# EAGLE schematic RU-PCBA-2X2-001-03 (EAGLE 9.7.0), part 1 of 5

## Sheet 1 of 17: Row 1
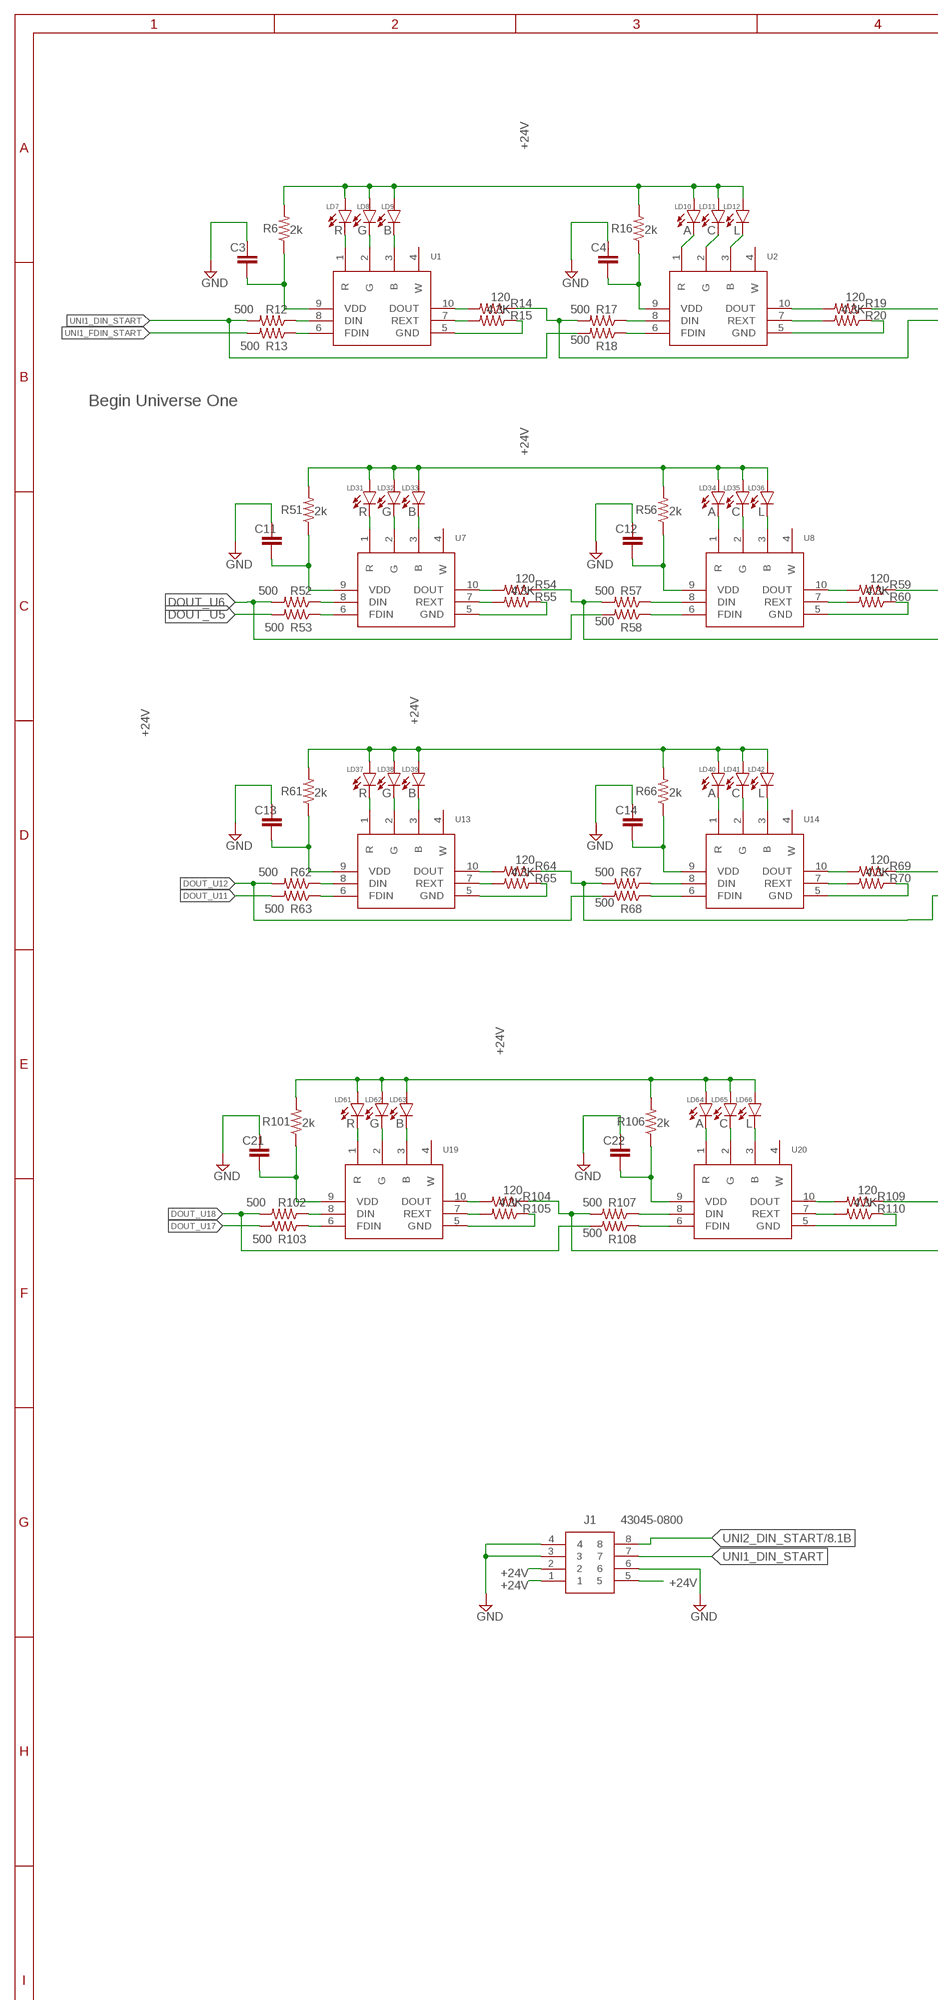
[diagram p0: schematic, sheet 1, part 1 of 2]
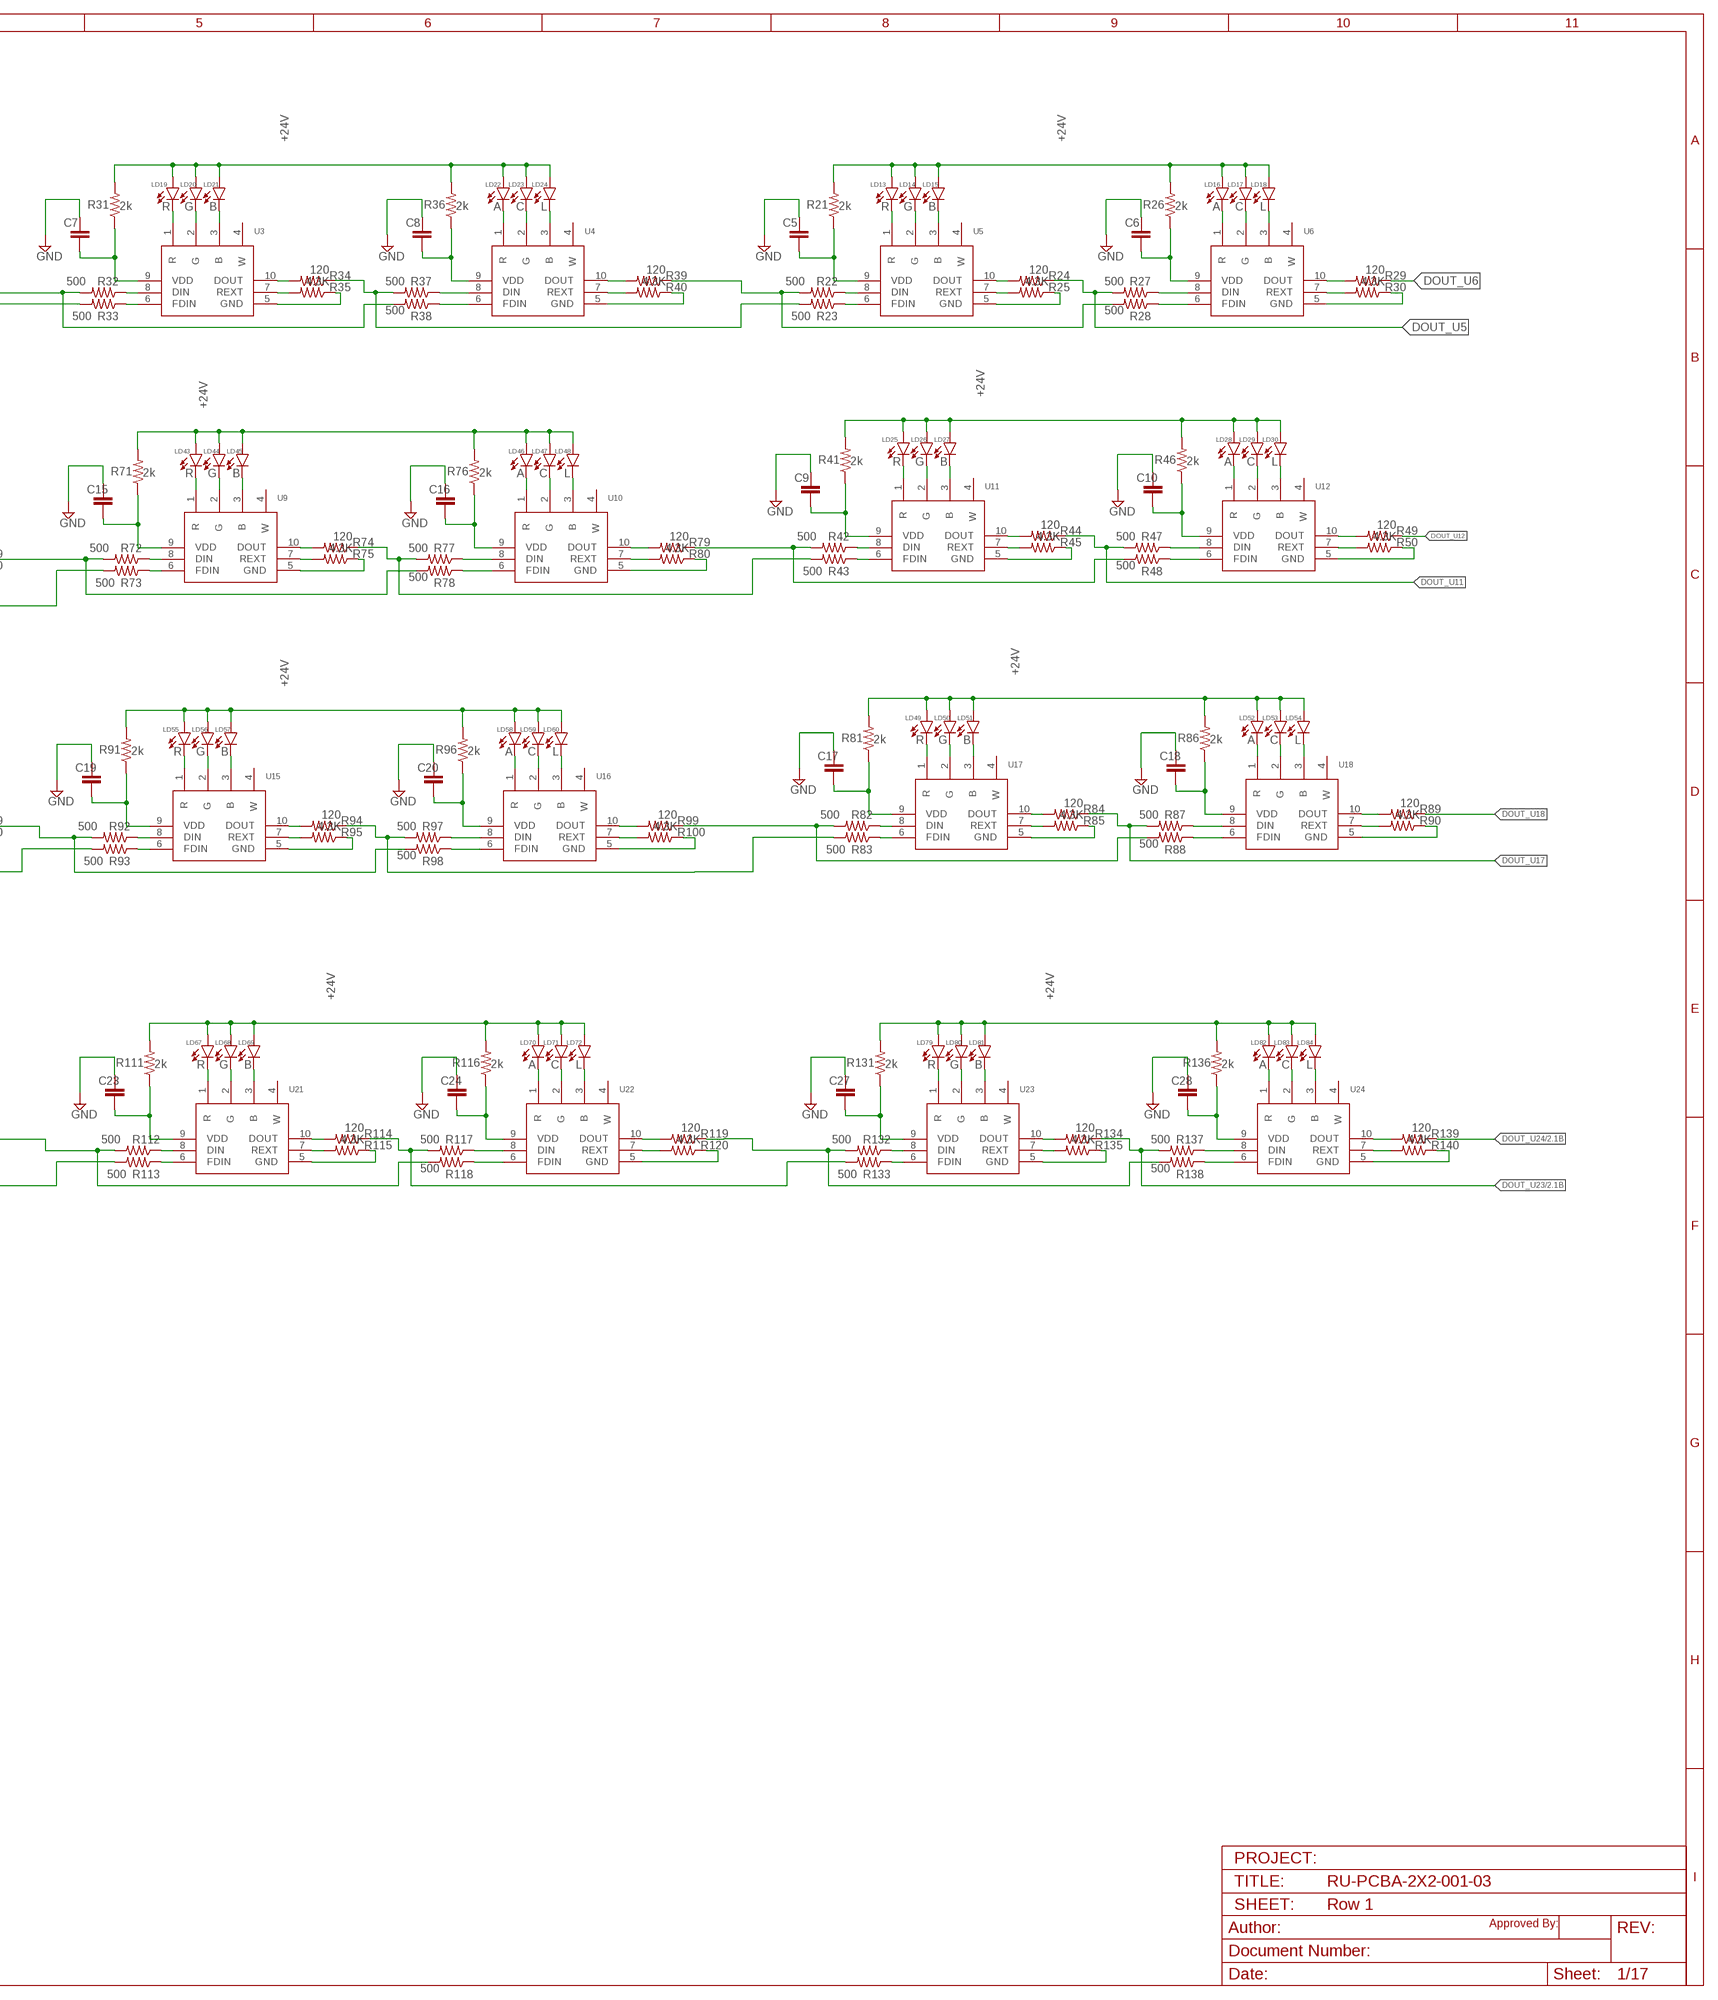
[diagram p1: schematic, sheet 1, part 2 of 2]

### Parts
C3  C-EUC1206  [C1206]
C4  C-EUC1206  [C1206]
C5  C-EUC1206  [C1206]
C6  C-EUC1206  [C1206]
C7  C-EUC1206  [C1206]
C8  C-EUC1206  [C1206]
C9  C-EUC1206  [C1206]
C10  C-EUC1206  [C1206]
C11  C-EUC1206  [C1206]
C12  C-EUC1206  [C1206]
C13  C-EUC1206  [C1206]
C14  C-EUC1206  [C1206]
C15  C-EUC1206  [C1206]
C16  C-EUC1206  [C1206]
C17  C-EUC1206  [C1206]
C18  C-EUC1206  [C1206]
C19  C-EUC1206  [C1206]
C20  C-EUC1206  [C1206]
C21  C-EUC1206  [C1206]
C22  C-EUC1206  [C1206]
C23  C-EUC1206  [C1206]
C24  C-EUC1206  [C1206]
C27  C-EUC1206  [C1206]
C28  C-EUC1206  [C1206]
J1  43045-0800  [43045-08(00,01,02,10)]
LD7  R  5050LED  [5050LED]
LD8  G  5050LED  [5050LED]
LD9  B  5050LED  [5050LED]
LD10  A  5050LED  [5050LED]
LD11  C  5050LED  [5050LED]
LD12  L  5050LED  [5050LED]
LD13  R  5050LED  [5050LED]
LD14  G  5050LED  [5050LED]
LD15  B  5050LED  [5050LED]
LD16  A  5050LED  [5050LED]
LD17  C  5050LED  [5050LED]
LD18  L  5050LED  [5050LED]
LD19  R  5050LED  [5050LED]
LD20  G  5050LED  [5050LED]
LD21  B  5050LED  [5050LED]
LD22  A  5050LED  [5050LED]
LD23  C  5050LED  [5050LED]
LD24  L  5050LED  [5050LED]
LD25  R  5050LED  [5050LED]
LD26  G  5050LED  [5050LED]
LD27  B  5050LED  [5050LED]
LD28  A  5050LED  [5050LED]
LD29  C  5050LED  [5050LED]
LD30  L  5050LED  [5050LED]
LD31  R  5050LED  [5050LED]
LD32  G  5050LED  [5050LED]
LD33  B  5050LED  [5050LED]
LD34  A  5050LED  [5050LED]
LD35  C  5050LED  [5050LED]
LD36  L  5050LED  [5050LED]
LD37  R  5050LED  [5050LED]
LD38  G  5050LED  [5050LED]
LD39  B  5050LED  [5050LED]
LD40  A  5050LED  [5050LED]
LD41  C  5050LED  [5050LED]
LD42  L  5050LED  [5050LED]
LD43  R  5050LED  [5050LED]
LD44  G  5050LED  [5050LED]
LD45  B  5050LED  [5050LED]
LD46  A  5050LED  [5050LED]
LD47  C  5050LED  [5050LED]
LD48  L  5050LED  [5050LED]
LD49  R  5050LED  [5050LED]
LD50  G  5050LED  [5050LED]
LD51  B  5050LED  [5050LED]
LD52  A  5050LED  [5050LED]
LD53  C  5050LED  [5050LED]
LD54  L  5050LED  [5050LED]
LD55  R  5050LED  [5050LED]
LD56  G  5050LED  [5050LED]
LD57  B  5050LED  [5050LED]
LD58  A  5050LED  [5050LED]
LD59  C  5050LED  [5050LED]
LD60  L  5050LED  [5050LED]
LD61  R  5050LED  [5050LED]
LD62  G  5050LED  [5050LED]
LD63  B  5050LED  [5050LED]
LD64  A  5050LED  [5050LED]
LD65  C  5050LED  [5050LED]
LD66  L  5050LED  [5050LED]
LD67  R  5050LED  [5050LED]
LD68  G  5050LED  [5050LED]
LD69  B  5050LED  [5050LED]
LD70  A  5050LED  [5050LED]
LD71  C  5050LED  [5050LED]
LD72  L  5050LED  [5050LED]
LD79  R  5050LED  [5050LED]
LD80  G  5050LED  [5050LED]
LD81  B  5050LED  [5050LED]
LD82  A  5050LED  [5050LED]
LD83  C  5050LED  [5050LED]
LD84  L  5050LED  [5050LED]
R6  2k  R-US_R1206  [R1206]
R12  500  R-US_R0805  [R0805]
R13  500  R-US_R0805  [R0805]
R14  120  R-US_R0805  [R0805]
R15  4.3K  R-US_R0805  [R0805]
R16  2k  R-US_R1206  [R1206]
R17  500  R-US_R0805  [R0805]
R18  500  R-US_R0805  [R0805]
R19  120  R-US_R0805  [R0805]
R20  4.3K  R-US_R0805  [R0805]
R21  2k  R-US_R1206  [R1206]
R22  500  R-US_R0805  [R0805]
R23  500  R-US_R0805  [R0805]
R24  120  R-US_R0805  [R0805]
R25  4.3K  R-US_R0805  [R0805]
R26  2k  R-US_R1206  [R1206]
R27  500  R-US_R0805  [R0805]
R28  500  R-US_R0805  [R0805]
R29  120  R-US_R0805  [R0805]
R30  4.3K  R-US_R0805  [R0805]
R31  2k  R-US_R1206  [R1206]
R32  500  R-US_R0805  [R0805]
R33  500  R-US_R0805  [R0805]
R34  120  R-US_R0805  [R0805]
R35  4.3K  R-US_R0805  [R0805]
R36  2k  R-US_R1206  [R1206]
R37  500  R-US_R0805  [R0805]
R38  500  R-US_R0805  [R0805]
R39  120  R-US_R0805  [R0805]
R40  4.3K  R-US_R0805  [R0805]
R41  2k  R-US_R1206  [R1206]
R42  500  R-US_R0805  [R0805]
R43  500  R-US_R0805  [R0805]
R44  120  R-US_R0805  [R0805]
R45  4.3K  R-US_R0805  [R0805]
R46  2k  R-US_R1206  [R1206]
R47  500  R-US_R0805  [R0805]
R48  500  R-US_R0805  [R0805]
R49  120  R-US_R0805  [R0805]
R50  4.3K  R-US_R0805  [R0805]
R51  2k  R-US_R1206  [R1206]
R52  500  R-US_R0805  [R0805]
R53  500  R-US_R0805  [R0805]
R54  120  R-US_R0805  [R0805]
R55  4.3K  R-US_R0805  [R0805]
R56  2k  R-US_R1206  [R1206]
R57  500  R-US_R0805  [R0805]
R58  500  R-US_R0805  [R0805]
R59  120  R-US_R0805  [R0805]
R60  4.3K  R-US_R0805  [R0805]
R61  2k  R-US_R1206  [R1206]
R62  500  R-US_R0805  [R0805]
R63  500  R-US_R0805  [R0805]
R64  120  R-US_R0805  [R0805]
R65  4.3K  R-US_R0805  [R0805]
R66  2k  R-US_R1206  [R1206]
R67  500  R-US_R0805  [R0805]
R68  500  R-US_R0805  [R0805]
R69  120  R-US_R0805  [R0805]
R70  4.3K  R-US_R0805  [R0805]
R71  2k  R-US_R1206  [R1206]
R72  500  R-US_R0805  [R0805]
R73  500  R-US_R0805  [R0805]
R74  120  R-US_R0805  [R0805]
R75  4.3K  R-US_R0805  [R0805]
R76  2k  R-US_R1206  [R1206]
R77  500  R-US_R0805  [R0805]
R78  500  R-US_R0805  [R0805]
R79  120  R-US_R0805  [R0805]
R80  4.3K  R-US_R0805  [R0805]
R81  2k  R-US_R1206  [R1206]
R82  500  R-US_R0805  [R0805]
R83  500  R-US_R0805  [R0805]
R84  120  R-US_R0805  [R0805]
R85  4.3K  R-US_R0805  [R0805]
R86  2k  R-US_R1206  [R1206]
R87  500  R-US_R0805  [R0805]
R88  500  R-US_R0805  [R0805]
R89  120  R-US_R0805  [R0805]
R90  4.3K  R-US_R0805  [R0805]
R91  2k  R-US_R1206  [R1206]
R92  500  R-US_R0805  [R0805]
R93  500  R-US_R0805  [R0805]
R94  120  R-US_R0805  [R0805]
R95  4.3K  R-US_R0805  [R0805]
R96  2k  R-US_R1206  [R1206]
R97  500  R-US_R0805  [R0805]
R98  500  R-US_R0805  [R0805]
R99  120  R-US_R0805  [R0805]
R100  4.3K  R-US_R0805  [R0805]
R101  2k  R-US_R1206  [R1206]
R102  500  R-US_R0805  [R0805]
R103  500  R-US_R0805  [R0805]
R104  120  R-US_R0805  [R0805]
R105  4.3K  R-US_R0805  [R0805]
R106  2k  R-US_R1206  [R1206]
R107  500  R-US_R0805  [R0805]
R108  500  R-US_R0805  [R0805]
R109  120  R-US_R0805  [R0805]
R110  4.3K  R-US_R0805  [R0805]
R111  2k  R-US_R1206  [R1206]
R112  500  R-US_R0805  [R0805]
R113  500  R-US_R0805  [R0805]
R114  120  R-US_R0805  [R0805]
R115  4.3K  R-US_R0805  [R0805]
R116  2k  R-US_R1206  [R1206]
R117  500  R-US_R0805  [R0805]
R118  500  R-US_R0805  [R0805]
R119  120  R-US_R0805  [R0805]
R120  4.3K  R-US_R0805  [R0805]
R131  2k  R-US_R1206  [R1206]
R132  500  R-US_R0805  [R0805]
R133  500  R-US_R0805  [R0805]
R134  120  R-US_R0805  [R0805]
R135  4.3K  R-US_R0805  [R0805]
R136  2k  R-US_R1206  [R1206]
R137  500  R-US_R0805  [R0805]
R138  500  R-US_R0805  [R0805]
R139  120  R-US_R0805  [R0805]
R140  4.3K  R-US_R0805  [R0805]
U1  UCS7604  [SOP100P600X175-10N]
U2  UCS7604  [SOP100P600X175-10N]
U3  UCS7604  [SOP100P600X175-10N]
U4  UCS7604  [SOP100P600X175-10N]
U5  UCS7604  [SOP100P600X175-10N]
U6  UCS7604  [SOP100P600X175-10N]
U7  UCS7604  [SOP100P600X175-10N]
U8  UCS7604  [SOP100P600X175-10N]
U9  UCS7604  [SOP100P600X175-10N]
U10  UCS7604  [SOP100P600X175-10N]
U11  UCS7604  [SOP100P600X175-10N]
U12  UCS7604  [SOP100P600X175-10N]
U13  UCS7604  [SOP100P600X175-10N]
U14  UCS7604  [SOP100P600X175-10N]
U15  UCS7604  [SOP100P600X175-10N]
U16  UCS7604  [SOP100P600X175-10N]
U17  UCS7604  [SOP100P600X175-10N]
U18  UCS7604  [SOP100P600X175-10N]
U19  UCS7604  [SOP100P600X175-10N]
U20  UCS7604  [SOP100P600X175-10N]
U21  UCS7604  [SOP100P600X175-10N]
U22  UCS7604  [SOP100P600X175-10N]
U23  UCS7604  [SOP100P600X175-10N]
U24  UCS7604  [SOP100P600X175-10N]

### Nets
+24V: J1.1 J1.2 J1.5 LD7.A LD8.A LD9.A LD10.A LD11.A LD12.A LD13.A LD14.A LD15.A LD16.A LD17.A LD18.A LD19.A LD20.A LD21.A LD22.A LD23.A LD24.A LD25.A LD26.A LD27.A LD28.A LD29.A LD30.A LD31.A LD32.A LD33.A LD34.A LD35.A LD36.A LD37.A LD38.A LD39.A LD40.A LD41.A LD42.A LD43.A LD44.A LD45.A LD46.A LD47.A LD48.A LD49.A LD50.A LD51.A LD52.A LD53.A LD54.A LD55.A LD56.A LD57.A LD58.A LD59.A LD60.A LD61.A LD62.A LD63.A LD64.A LD65.A LD66.A LD67.A LD68.A LD69.A LD70.A LD71.A LD72.A LD79.A LD80.A LD81.A LD82.A LD83.A LD84.A R6.2 R16.2 R21.2 R26.2 R31.2 R36.2 R41.2 R46.2 R51.2 R56.2 R61.2 R66.2 R71.2 R76.2 R81.2 R86.2 R91.2 R96.2 R101.2 R106.2 R111.2 R116.2 R131.2 R136.2 ; also sheet 2,3,4,5,6,7,8,9,10,11,12,13,14
DOUT_U5: R24.1 R27.2 R53.2
DOUT_U6: R29.1 R52.2 R58.2
DOUT_U11: R44.1 R47.2 R63.2
DOUT_U12: R49.1 R62.2 R68.2
DOUT_U17: R84.1 R87.2 R103.2
DOUT_U18: R89.1 R102.2 R108.2
DOUT_U23: R134.1 R137.2 ; also sheet 2
DOUT_U24: R139.1 ; also sheet 2
GND: C3.2 C4.2 C5.2 C6.2 C7.2 C8.2 C9.2 C10.2 C11.2 C12.2 C13.2 C14.2 C15.2 C16.2 C17.2 C18.2 C19.2 C20.2 C21.2 C22.2 C23.2 C24.2 C27.2 C28.2 J1.3 J1.4 J1.6 R15.1 R20.1 R25.1 R30.1 R35.1 R40.1 R45.1 R50.1 R55.1 R60.1 R65.1 R70.1 R75.1 R80.1 R85.1 R90.1 R95.1 R100.1 R105.1 R110.1 R115.1 R120.1 R135.1 R140.1 U1.5(GND) U2.5(GND) U3.5(GND) U4.5(GND) U5.5(GND) U6.5(GND) U7.5(GND) U8.5(GND) U9.5(GND) U10.5(GND) U11.5(GND) U12.5(GND) U13.5(GND) U14.5(GND) U15.5(GND) U16.5(GND) U17.5(GND) U18.5(GND) U19.5(GND) U20.5(GND) U21.5(GND) U22.5(GND) U23.5(GND) U24.5(GND) ; also sheet 2,3,4,5,6,7,8,9,10,11,12,13,14
N$22: C3.1 R6.1 U1.9(VDD)
N$24: LD7.K(C) U1.1(R)
N$25: LD8.K(C) U1.2(G)
N$26: LD9.K(C) U1.3(B)
N$27: R12.1 U1.8(DIN)
N$28: R13.1 U1.6(FDIN)
N$29: R14.2 U1.10(DOUT)
N$30: R15.2 U1.7(REXT)
N$31: LD10.K(C) U2.1(R)
N$32: LD11.K(C) U2.2(G)
N$33: LD12.K(C) U2.3(B)
N$34: C4.1 R16.1 U2.9(VDD)
N$35: R17.1 U2.8(DIN)
N$37: R18.1 U2.6(FDIN)
N$40: R19.2 U2.10(DOUT)
N$41: R20.2 U2.7(REXT)
N$42: R19.1 R32.2 R38.2
N$44: C5.1 R21.1 U5.9(VDD)
N$45: LD13.K(C) U5.1(R)
N$46: LD14.K(C) U5.2(G)
N$47: LD15.K(C) U5.3(B)
N$48: R22.1 U5.8(DIN)
N$49: R23.1 U5.6(FDIN)
N$50: R24.2 U5.10(DOUT)
N$51: R25.2 U5.7(REXT)
N$52: LD16.K(C) U6.1(R)
N$53: LD17.K(C) U6.2(G)
N$54: LD18.K(C) U6.3(B)
N$55: C6.1 R26.1 U6.9(VDD)
N$56: R27.1 U6.8(DIN)
N$58: R28.1 U6.6(FDIN)
N$61: R29.2 U6.10(DOUT)
N$62: R30.2 U6.7(REXT)
N$65: C7.1 R31.1 U3.9(VDD)
N$66: LD19.K(C) U3.1(R)
N$67: LD20.K(C) U3.2(G)
N$68: LD21.K(C) U3.3(B)
N$69: R32.1 U3.8(DIN)
N$70: R33.1 U3.6(FDIN)
N$71: R34.2 U3.10(DOUT)
N$72: R35.2 U3.7(REXT)
N$73: LD22.K(C) U4.1(R)
N$74: LD23.K(C) U4.2(G)
N$75: LD24.K(C) U4.3(B)
N$76: C8.1 R36.1 U4.9(VDD)
N$77: R37.1 U4.8(DIN)
N$78: R23.2 R34.1 R37.2
N$79: R38.1 U4.6(FDIN)
N$81: R14.1 R17.2 R33.2
N$82: R39.2 U4.10(DOUT)
N$83: R40.2 U4.7(REXT)
N$84: R22.2 R28.2 R39.1
N$86: C9.1 R41.1 U11.9(VDD)
N$87: LD25.K(C) U11.1(R)
N$88: LD26.K(C) U11.2(G)
N$89: LD27.K(C) U11.3(B)
N$90: R42.1 U11.8(DIN)
N$91: R43.1 U11.6(FDIN)
N$92: R44.2 U11.10(DOUT)
N$93: R45.2 U11.7(REXT)
N$94: LD28.K(C) U12.1(R)
N$95: LD29.K(C) U12.2(G)
N$96: LD30.K(C) U12.3(B)
N$97: C10.1 R46.1 U12.9(VDD)
N$98: R47.1 U12.8(DIN)
N$100: R48.1 U12.6(FDIN)
N$103: R49.2 U12.10(DOUT)
N$104: R50.2 U12.7(REXT)
N$107: C11.1 R51.1 U7.9(VDD)
N$108: LD31.K(C) U7.1(R)
N$109: LD32.K(C) U7.2(G)
N$110: LD33.K(C) U7.3(B)
N$111: R52.1 U7.8(DIN)
N$112: R53.1 U7.6(FDIN)
N$113: R54.2 U7.10(DOUT)
N$114: R55.2 U7.7(REXT)
N$115: LD34.K(C) U8.1(R)
N$116: LD35.K(C) U8.2(G)
N$117: LD36.K(C) U8.3(B)
N$118: C12.1 R56.1 U8.9(VDD)
N$119: R57.1 U8.8(DIN)
N$120: R54.1 R57.2 R73.2
N$121: R58.1 U8.6(FDIN)
N$124: R59.2 U8.10(DOUT)
N$125: R60.2 U8.7(REXT)
N$126: R59.1 R72.2 R78.2
N$128: C13.1 R61.1 U13.9(VDD)
N$129: LD37.K(C) U13.1(R)
N$130: LD38.K(C) U13.2(G)
N$131: LD39.K(C) U13.3(B)
N$132: R62.1 U13.8(DIN)
N$133: R63.1 U13.6(FDIN)
N$134: R64.2 U13.10(DOUT)
N$135: R65.2 U13.7(REXT)
N$136: LD40.K(C) U14.1(R)
N$137: LD41.K(C) U14.2(G)
N$138: LD42.K(C) U14.3(B)
N$139: C14.1 R66.1 U14.9(VDD)
N$140: R67.1 U14.8(DIN)
N$142: R68.1 U14.6(FDIN)
N$145: R69.2 U14.10(DOUT)
N$146: R70.2 U14.7(REXT)
N$147: R69.1 R92.2 R98.2
N$149: C15.1 R71.1 U9.9(VDD)
N$150: LD43.K(C) U9.1(R)
N$151: LD44.K(C) U9.2(G)
N$152: LD45.K(C) U9.3(B)
N$153: R72.1 U9.8(DIN)
N$154: R73.1 U9.6(FDIN)
N$155: R74.2 U9.10(DOUT)
N$156: R75.2 U9.7(REXT)
N$157: LD46.K(C) U10.1(R)
N$158: LD47.K(C) U10.2(G)
N$159: LD48.K(C) U10.3(B)
N$160: C16.1 R76.1 U10.9(VDD)
N$161: R77.1 U10.8(DIN)
N$162: R43.2 R74.1 R77.2
N$163: R78.1 U10.6(FDIN)
N$166: R79.2 U10.10(DOUT)
N$167: R80.2 U10.7(REXT)
N$168: R42.2 R48.2 R79.1
N$170: C17.1 R81.1 U17.9(VDD)
N$171: LD49.K(C) U17.1(R)
N$172: LD50.K(C) U17.2(G)
N$173: LD51.K(C) U17.3(B)
N$174: R82.1 U17.8(DIN)
N$175: R83.1 U17.6(FDIN)
N$176: R84.2 U17.10(DOUT)
N$177: R85.2 U17.7(REXT)
N$178: LD52.K(C) U18.1(R)
N$179: LD53.K(C) U18.2(G)
N$180: LD54.K(C) U18.3(B)
N$181: C18.1 R86.1 U18.9(VDD)
N$182: R87.1 U18.8(DIN)
N$184: R88.1 U18.6(FDIN)
N$185: R82.2 R88.2 R99.1
N$186: R83.2 R94.1 R97.2
N$187: R89.2 U18.10(DOUT)
N$188: R90.2 U18.7(REXT)
N$191: C19.1 R91.1 U15.9(VDD)
N$192: LD55.K(C) U15.1(R)
N$193: LD56.K(C) U15.2(G)
N$194: LD57.K(C) U15.3(B)
N$195: R92.1 U15.8(DIN)
N$196: R93.1 U15.6(FDIN)
N$197: R94.2 U15.10(DOUT)
N$198: R95.2 U15.7(REXT)
N$199: LD58.K(C) U16.1(R)
N$200: LD59.K(C) U16.2(G)
N$201: LD60.K(C) U16.3(B)
N$202: C20.1 R96.1 U16.9(VDD)
N$203: R97.1 U16.8(DIN)
N$205: R98.1 U16.6(FDIN)
N$207: R64.1 R67.2 R93.2
N$208: R99.2 U16.10(DOUT)
N$209: R100.2 U16.7(REXT)
N$212: C21.1 R101.1 U19.9(VDD)
N$213: LD61.K(C) U19.1(R)
N$214: LD62.K(C) U19.2(G)
N$215: LD63.K(C) U19.3(B)
N$216: R102.1 U19.8(DIN)
N$217: R103.1 U19.6(FDIN)
N$218: R104.2 U19.10(DOUT)
N$219: R105.2 U19.7(REXT)
N$220: LD64.K(C) U20.1(R)
N$221: LD65.K(C) U20.2(G)
N$222: LD66.K(C) U20.3(B)
N$223: C22.1 R106.1 U20.9(VDD)
N$224: R107.1 U20.8(DIN)
N$225: R104.1 R107.2 R113.2
N$226: R108.1 U20.6(FDIN)
N$229: R109.2 U20.10(DOUT)
N$230: R110.2 U20.7(REXT)
N$231: R109.1 R112.2 R118.2
N$233: C23.1 R111.1 U21.9(VDD)
N$234: LD67.K(C) U21.1(R)
N$235: LD68.K(C) U21.2(G)
N$236: LD69.K(C) U21.3(B)
N$237: R112.1 U21.8(DIN)
N$238: R113.1 U21.6(FDIN)
N$239: R114.2 U21.10(DOUT)
N$240: R115.2 U21.7(REXT)
N$241: LD70.K(C) U22.1(R)
N$242: LD71.K(C) U22.2(G)
N$243: LD72.K(C) U22.3(B)
N$244: C24.1 R116.1 U22.9(VDD)
N$245: R117.1 U22.8(DIN)
N$246: R114.1 R117.2 R133.2
N$247: R118.1 U22.6(FDIN)
N$250: R119.2 U22.10(DOUT)
N$251: R120.2 U22.7(REXT)
N$275: C27.1 R131.1 U23.9(VDD)
N$276: LD79.K(C) U23.1(R)
N$277: LD80.K(C) U23.2(G)
N$278: LD81.K(C) U23.3(B)
N$279: R132.1 U23.8(DIN)
N$280: R133.1 U23.6(FDIN)
N$281: R134.2 U23.10(DOUT)
N$282: R135.2 U23.7(REXT)
N$283: LD82.K(C) U24.1(R)
N$284: LD83.K(C) U24.2(G)
N$285: LD84.K(C) U24.3(B)
N$286: C28.1 R136.1 U24.9(VDD)
N$287: R137.1 U24.8(DIN)
N$289: R138.1 U24.6(FDIN)
N$290: R119.1 R132.2 R138.2
N$292: R139.2 U24.10(DOUT)
N$293: R140.2 U24.7(REXT)
UNI1_DIN_START: J1.7 R12.2 R18.2
UNI1_FDIN_START: R13.2
UNI2_DIN_START: J1.8 ; also sheet 8
Unconnected: U1.4(W) U2.4(W) U3.4(W) U4.4(W) U5.4(W) U6.4(W) U7.4(W) U8.4(W) U9.4(W) U10.4(W) U11.4(W) U12.4(W) U13.4(W) U14.4(W) U15.4(W) U16.4(W) U17.4(W) U18.4(W) U19.4(W) U20.4(W) U21.4(W) U22.4(W) U23.4(W) U24.4(W)

### Notes on the sheet
- Begin Universe One

## Sheet 2 of 17: Row 2
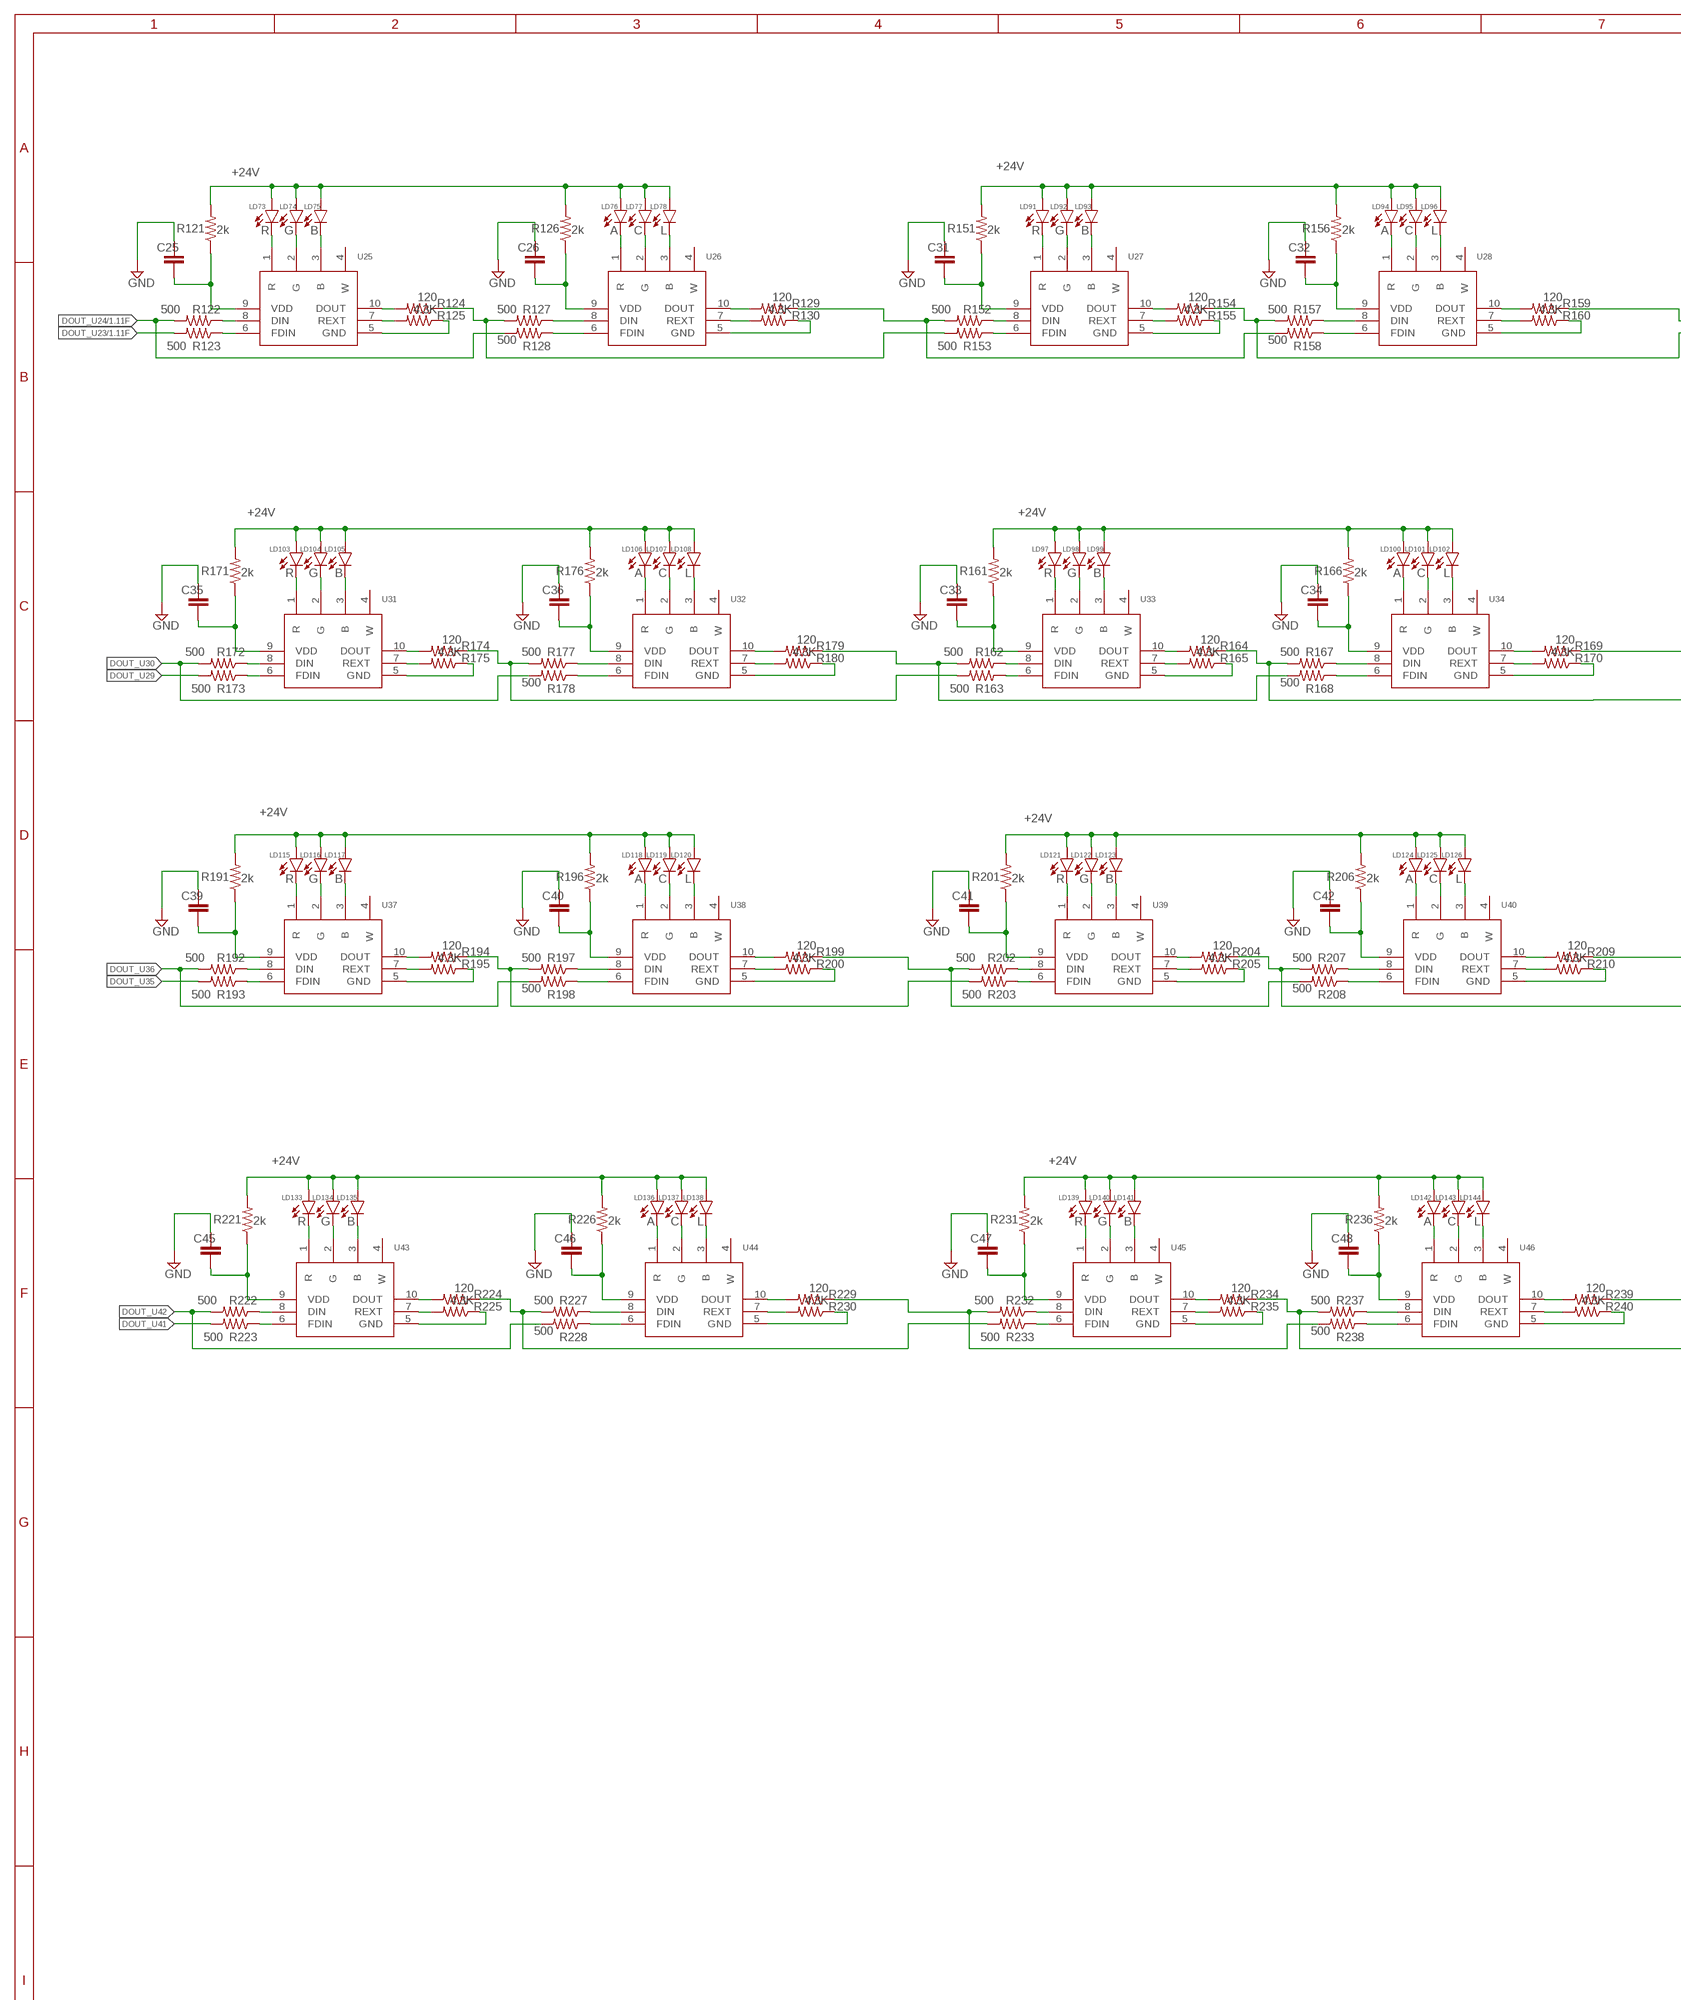
[diagram p2: schematic, sheet 2, part 1 of 2]
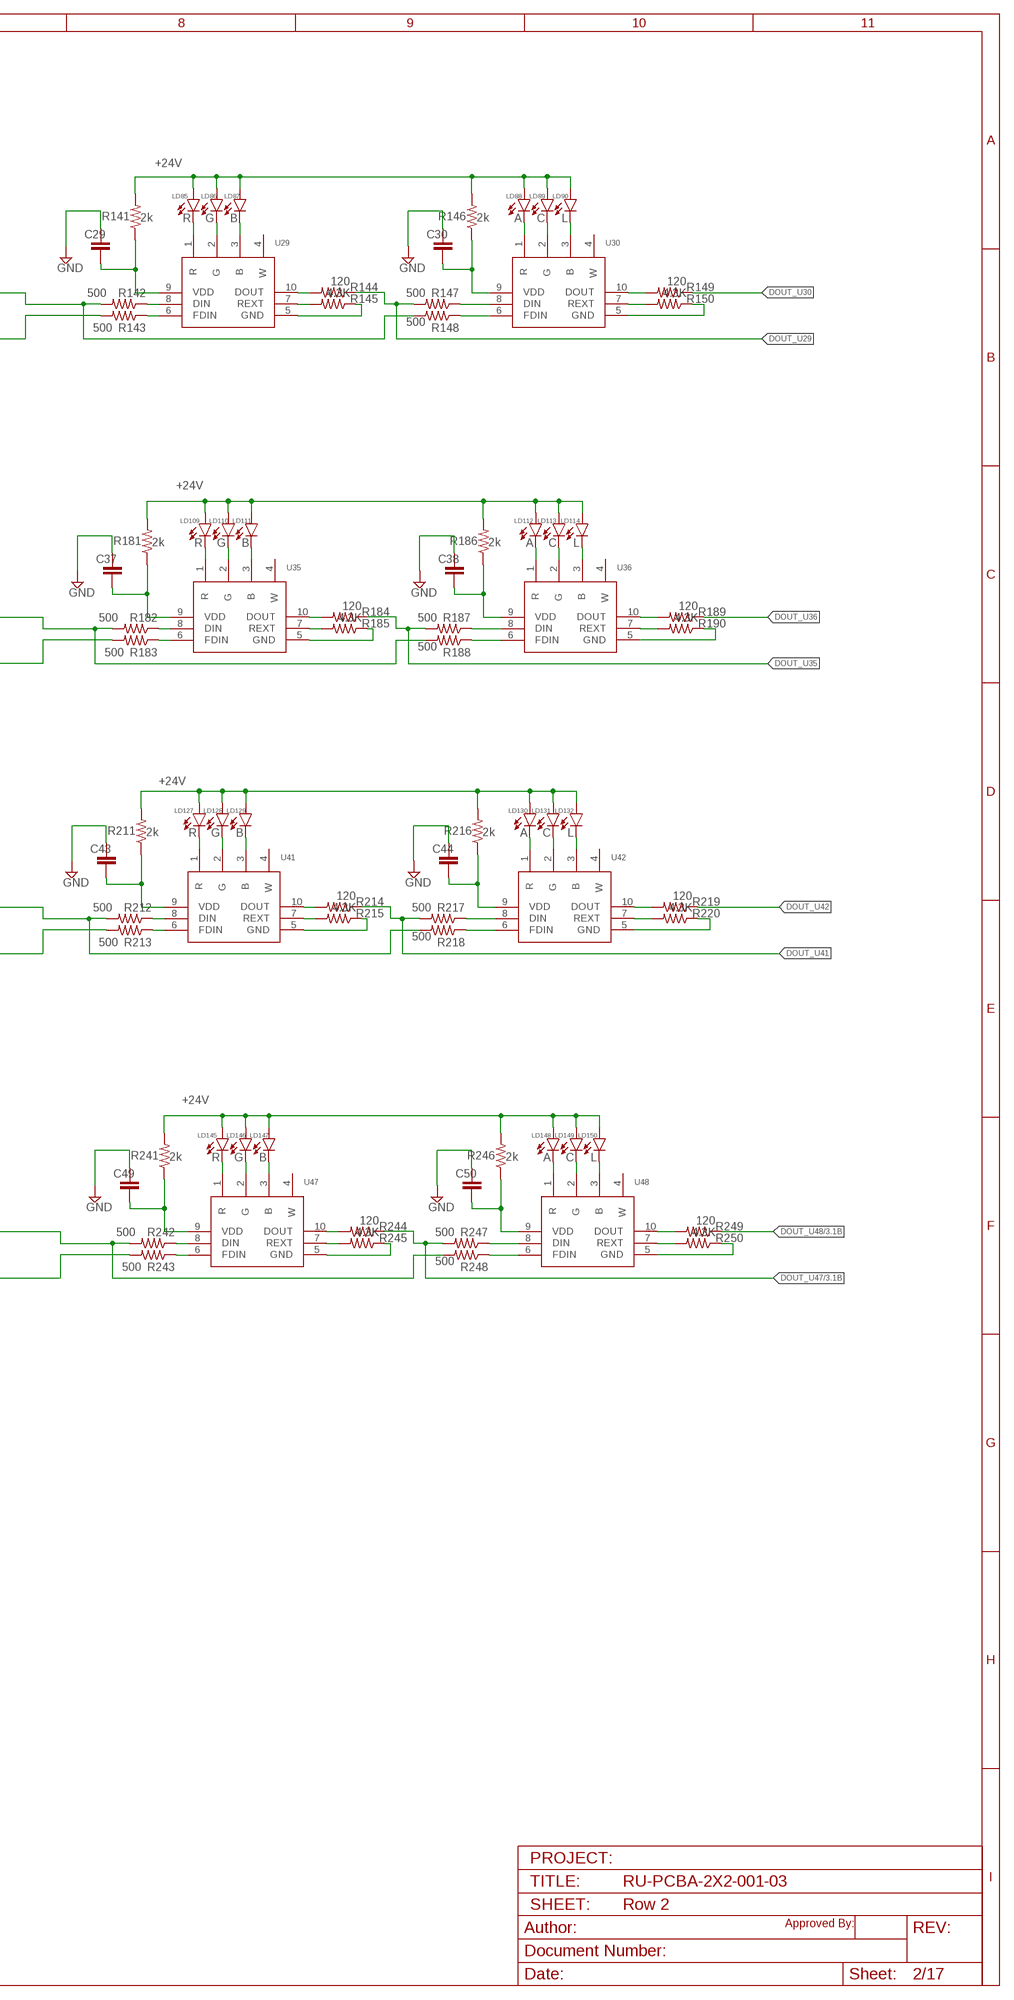
[diagram p3: schematic, sheet 2, part 2 of 2]

### Parts
C25  C-EUC1206  [C1206]
C26  C-EUC1206  [C1206]
C29  C-EUC1206  [C1206]
C30  C-EUC1206  [C1206]
C31  C-EUC1206  [C1206]
C32  C-EUC1206  [C1206]
C33  C-EUC1206  [C1206]
C34  C-EUC1206  [C1206]
C35  C-EUC1206  [C1206]
C36  C-EUC1206  [C1206]
C37  C-EUC1206  [C1206]
C38  C-EUC1206  [C1206]
C39  C-EUC1206  [C1206]
C40  C-EUC1206  [C1206]
C41  C-EUC1206  [C1206]
C42  C-EUC1206  [C1206]
C43  C-EUC1206  [C1206]
C44  C-EUC1206  [C1206]
C45  C-EUC1206  [C1206]
C46  C-EUC1206  [C1206]
C47  C-EUC1206  [C1206]
C48  C-EUC1206  [C1206]
C49  C-EUC1206  [C1206]
C50  C-EUC1206  [C1206]
LD73  R  5050LED  [5050LED]
LD74  G  5050LED  [5050LED]
LD75  B  5050LED  [5050LED]
LD76  A  5050LED  [5050LED]
LD77  C  5050LED  [5050LED]
LD78  L  5050LED  [5050LED]
LD85  R  5050LED  [5050LED]
LD86  G  5050LED  [5050LED]
LD87  B  5050LED  [5050LED]
LD88  A  5050LED  [5050LED]
LD89  C  5050LED  [5050LED]
LD90  L  5050LED  [5050LED]
LD91  R  5050LED  [5050LED]
LD92  G  5050LED  [5050LED]
LD93  B  5050LED  [5050LED]
LD94  A  5050LED  [5050LED]
LD95  C  5050LED  [5050LED]
LD96  L  5050LED  [5050LED]
LD97  R  5050LED  [5050LED]
LD98  G  5050LED  [5050LED]
LD99  B  5050LED  [5050LED]
LD100  A  5050LED  [5050LED]
LD101  C  5050LED  [5050LED]
LD102  L  5050LED  [5050LED]
LD103  R  5050LED  [5050LED]
LD104  G  5050LED  [5050LED]
LD105  B  5050LED  [5050LED]
LD106  A  5050LED  [5050LED]
LD107  C  5050LED  [5050LED]
LD108  L  5050LED  [5050LED]
LD109  R  5050LED  [5050LED]
LD110  G  5050LED  [5050LED]
LD111  B  5050LED  [5050LED]
LD112  A  5050LED  [5050LED]
LD113  C  5050LED  [5050LED]
LD114  L  5050LED  [5050LED]
LD115  R  5050LED  [5050LED]
LD116  G  5050LED  [5050LED]
LD117  B  5050LED  [5050LED]
LD118  A  5050LED  [5050LED]
LD119  C  5050LED  [5050LED]
LD120  L  5050LED  [5050LED]
LD121  R  5050LED  [5050LED]
LD122  G  5050LED  [5050LED]
LD123  B  5050LED  [5050LED]
LD124  A  5050LED  [5050LED]
LD125  C  5050LED  [5050LED]
LD126  L  5050LED  [5050LED]
LD127  R  5050LED  [5050LED]
LD128  G  5050LED  [5050LED]
LD129  B  5050LED  [5050LED]
LD130  A  5050LED  [5050LED]
LD131  C  5050LED  [5050LED]
LD132  L  5050LED  [5050LED]
LD133  R  5050LED  [5050LED]
LD134  G  5050LED  [5050LED]
LD135  B  5050LED  [5050LED]
LD136  A  5050LED  [5050LED]
LD137  C  5050LED  [5050LED]
LD138  L  5050LED  [5050LED]
LD139  R  5050LED  [5050LED]
LD140  G  5050LED  [5050LED]
LD141  B  5050LED  [5050LED]
LD142  A  5050LED  [5050LED]
LD143  C  5050LED  [5050LED]
LD144  L  5050LED  [5050LED]
LD145  R  5050LED  [5050LED]
LD146  G  5050LED  [5050LED]
LD147  B  5050LED  [5050LED]
LD148  A  5050LED  [5050LED]
LD149  C  5050LED  [5050LED]
LD150  L  5050LED  [5050LED]
R121  2k  R-US_R1206  [R1206]
R122  500  R-US_R0805  [R0805]
R123  500  R-US_R0805  [R0805]
R124  120  R-US_R0805  [R0805]
R125  4.3K  R-US_R0805  [R0805]
R126  2k  R-US_R1206  [R1206]
R127  500  R-US_R0805  [R0805]
R128  500  R-US_R0805  [R0805]
R129  120  R-US_R0805  [R0805]
R130  4.3K  R-US_R0805  [R0805]
R141  2k  R-US_R1206  [R1206]
R142  500  R-US_R0805  [R0805]
R143  500  R-US_R0805  [R0805]
R144  120  R-US_R0805  [R0805]
R145  4.3K  R-US_R0805  [R0805]
R146  2k  R-US_R1206  [R1206]
R147  500  R-US_R0805  [R0805]
R148  500  R-US_R0805  [R0805]
R149  120  R-US_R0805  [R0805]
R150  4.3K  R-US_R0805  [R0805]
R151  2k  R-US_R1206  [R1206]
R152  500  R-US_R0805  [R0805]
R153  500  R-US_R0805  [R0805]
R154  120  R-US_R0805  [R0805]
R155  4.3K  R-US_R0805  [R0805]
R156  2k  R-US_R1206  [R1206]
R157  500  R-US_R0805  [R0805]
R158  500  R-US_R0805  [R0805]
R159  120  R-US_R0805  [R0805]
R160  4.3K  R-US_R0805  [R0805]
R161  2k  R-US_R1206  [R1206]
R162  500  R-US_R0805  [R0805]
R163  500  R-US_R0805  [R0805]
R164  120  R-US_R0805  [R0805]
R165  4.3K  R-US_R0805  [R0805]
R166  2k  R-US_R1206  [R1206]
R167  500  R-US_R0805  [R0805]
R168  500  R-US_R0805  [R0805]
R169  120  R-US_R0805  [R0805]
R170  4.3K  R-US_R0805  [R0805]
R171  2k  R-US_R1206  [R1206]
R172  500  R-US_R0805  [R0805]
R173  500  R-US_R0805  [R0805]
R174  120  R-US_R0805  [R0805]
R175  4.3K  R-US_R0805  [R0805]
R176  2k  R-US_R1206  [R1206]
R177  500  R-US_R0805  [R0805]
R178  500  R-US_R0805  [R0805]
R179  120  R-US_R0805  [R0805]
R180  4.3K  R-US_R0805  [R0805]
R181  2k  R-US_R1206  [R1206]
R182  500  R-US_R0805  [R0805]
R183  500  R-US_R0805  [R0805]
R184  120  R-US_R0805  [R0805]
R185  4.3K  R-US_R0805  [R0805]
R186  2k  R-US_R1206  [R1206]
R187  500  R-US_R0805  [R0805]
R188  500  R-US_R0805  [R0805]
R189  120  R-US_R0805  [R0805]
R190  4.3K  R-US_R0805  [R0805]
R191  2k  R-US_R1206  [R1206]
R192  500  R-US_R0805  [R0805]
R193  500  R-US_R0805  [R0805]
R194  120  R-US_R0805  [R0805]
R195  4.3K  R-US_R0805  [R0805]
R196  2k  R-US_R1206  [R1206]
R197  500  R-US_R0805  [R0805]
R198  500  R-US_R0805  [R0805]
R199  120  R-US_R0805  [R0805]
R200  4.3K  R-US_R0805  [R0805]
R201  2k  R-US_R1206  [R1206]
R202  500  R-US_R0805  [R0805]
R203  500  R-US_R0805  [R0805]
R204  120  R-US_R0805  [R0805]
R205  4.3K  R-US_R0805  [R0805]
R206  2k  R-US_R1206  [R1206]
R207  500  R-US_R0805  [R0805]
R208  500  R-US_R0805  [R0805]
R209  120  R-US_R0805  [R0805]
R210  4.3K  R-US_R0805  [R0805]
R211  2k  R-US_R1206  [R1206]
R212  500  R-US_R0805  [R0805]
R213  500  R-US_R0805  [R0805]
R214  120  R-US_R0805  [R0805]
R215  4.3K  R-US_R0805  [R0805]
R216  2k  R-US_R1206  [R1206]
R217  500  R-US_R0805  [R0805]
R218  500  R-US_R0805  [R0805]
R219  120  R-US_R0805  [R0805]
R220  4.3K  R-US_R0805  [R0805]
R221  2k  R-US_R1206  [R1206]
R222  500  R-US_R0805  [R0805]
R223  500  R-US_R0805  [R0805]
R224  120  R-US_R0805  [R0805]
R225  4.3K  R-US_R0805  [R0805]
R226  2k  R-US_R1206  [R1206]
R227  500  R-US_R0805  [R0805]
R228  500  R-US_R0805  [R0805]
R229  120  R-US_R0805  [R0805]
R230  4.3K  R-US_R0805  [R0805]
R231  2k  R-US_R1206  [R1206]
R232  500  R-US_R0805  [R0805]
R233  500  R-US_R0805  [R0805]
R234  120  R-US_R0805  [R0805]
R235  4.3K  R-US_R0805  [R0805]
R236  2k  R-US_R1206  [R1206]
R237  500  R-US_R0805  [R0805]
R238  500  R-US_R0805  [R0805]
R239  120  R-US_R0805  [R0805]
R240  4.3K  R-US_R0805  [R0805]
R241  2k  R-US_R1206  [R1206]
R242  500  R-US_R0805  [R0805]
R243  500  R-US_R0805  [R0805]
R244  120  R-US_R0805  [R0805]
R245  4.3K  R-US_R0805  [R0805]
R246  2k  R-US_R1206  [R1206]
R247  500  R-US_R0805  [R0805]
R248  500  R-US_R0805  [R0805]
R249  120  R-US_R0805  [R0805]
R250  4.3K  R-US_R0805  [R0805]
U25  UCS7604  [SOP100P600X175-10N]
U26  UCS7604  [SOP100P600X175-10N]
U27  UCS7604  [SOP100P600X175-10N]
U28  UCS7604  [SOP100P600X175-10N]
U29  UCS7604  [SOP100P600X175-10N]
U30  UCS7604  [SOP100P600X175-10N]
U31  UCS7604  [SOP100P600X175-10N]
U32  UCS7604  [SOP100P600X175-10N]
U33  UCS7604  [SOP100P600X175-10N]
U34  UCS7604  [SOP100P600X175-10N]
U35  UCS7604  [SOP100P600X175-10N]
U36  UCS7604  [SOP100P600X175-10N]
U37  UCS7604  [SOP100P600X175-10N]
U38  UCS7604  [SOP100P600X175-10N]
U39  UCS7604  [SOP100P600X175-10N]
U40  UCS7604  [SOP100P600X175-10N]
U41  UCS7604  [SOP100P600X175-10N]
U42  UCS7604  [SOP100P600X175-10N]
U43  UCS7604  [SOP100P600X175-10N]
U44  UCS7604  [SOP100P600X175-10N]
U45  UCS7604  [SOP100P600X175-10N]
U46  UCS7604  [SOP100P600X175-10N]
U47  UCS7604  [SOP100P600X175-10N]
U48  UCS7604  [SOP100P600X175-10N]

### Nets
+24V: LD73.A LD74.A LD75.A LD76.A LD77.A LD78.A LD85.A LD86.A LD87.A LD88.A LD89.A LD90.A LD91.A LD92.A LD93.A LD94.A LD95.A LD96.A LD97.A LD98.A LD99.A LD100.A LD101.A LD102.A LD103.A LD104.A LD105.A LD106.A LD107.A LD108.A LD109.A LD110.A LD111.A LD112.A LD113.A LD114.A LD115.A LD116.A LD117.A LD118.A LD119.A LD120.A LD121.A LD122.A LD123.A LD124.A LD125.A LD126.A LD127.A LD128.A LD129.A LD130.A LD131.A LD132.A LD133.A LD134.A LD135.A LD136.A LD137.A LD138.A LD139.A LD140.A LD141.A LD142.A LD143.A LD144.A LD145.A LD146.A LD147.A LD148.A LD149.A LD150.A R121.2 R126.2 R141.2 R146.2 R151.2 R156.2 R161.2 R166.2 R171.2 R176.2 R181.2 R186.2 R191.2 R196.2 R201.2 R206.2 R211.2 R216.2 R221.2 R226.2 R231.2 R236.2 R241.2 R246.2 ; also sheet 1,3,4,5,6,7,8,9,10,11,12,13,14
DOUT_U23: R123.2 ; also sheet 1
DOUT_U24: R122.2 R128.2 ; also sheet 1
DOUT_U29: R144.1 R147.2 R173.2
DOUT_U30: R149.1 R172.2 R178.2
DOUT_U35: R184.1 R187.2 R193.2
DOUT_U36: R189.1 R192.2 R198.2
DOUT_U41: R214.1 R217.2 R223.2
DOUT_U42: R219.1 R222.2 R228.2
DOUT_U47: R244.1 R247.2 ; also sheet 3
DOUT_U48: R249.1 ; also sheet 3
GND: C25.2 C26.2 C29.2 C30.2 C31.2 C32.2 C33.2 C34.2 C35.2 C36.2 C37.2 C38.2 C39.2 C40.2 C41.2 C42.2 C43.2 C44.2 C45.2 C46.2 C47.2 C48.2 C49.2 C50.2 R125.1 R130.1 R145.1 R150.1 R155.1 R160.1 R165.1 R170.1 R175.1 R180.1 R185.1 R190.1 R195.1 R200.1 R205.1 R210.1 R215.1 R220.1 R225.1 R230.1 R235.1 R240.1 R245.1 R250.1 U25.5(GND) U26.5(GND) U27.5(GND) U28.5(GND) U29.5(GND) U30.5(GND) U31.5(GND) U32.5(GND) U33.5(GND) U34.5(GND) U35.5(GND) U36.5(GND) U37.5(GND) U38.5(GND) U39.5(GND) U40.5(GND) U41.5(GND) U42.5(GND) U43.5(GND) U44.5(GND) U45.5(GND) U46.5(GND) U47.5(GND) U48.5(GND) ; also sheet 1,3,4,5,6,7,8,9,10,11,12,13,14
N$254: C25.1 R121.1 U25.9(VDD)
N$255: LD73.K(C) U25.1(R)
N$256: LD74.K(C) U25.2(G)
N$257: LD75.K(C) U25.3(B)
N$258: R122.1 U25.8(DIN)
N$259: R123.1 U25.6(FDIN)
N$260: R124.2 U25.10(DOUT)
N$261: R125.2 U25.7(REXT)
N$262: LD76.K(C) U26.1(R)
N$263: LD77.K(C) U26.2(G)
N$264: LD78.K(C) U26.3(B)
N$265: C26.1 R126.1 U26.9(VDD)
N$266: R127.1 U26.8(DIN)
N$268: R128.1 U26.6(FDIN)
N$271: R129.2 U26.10(DOUT)
N$272: R130.2 U26.7(REXT)
N$273: R129.1 R152.2 R158.2
N$296: C29.1 R141.1 U29.9(VDD)
N$297: LD85.K(C) U29.1(R)
N$298: LD86.K(C) U29.2(G)
N$299: LD87.K(C) U29.3(B)
N$300: R142.1 U29.8(DIN)
N$301: R143.1 U29.6(FDIN)
N$302: R144.2 U29.10(DOUT)
N$303: R145.2 U29.7(REXT)
N$304: LD88.K(C) U30.1(R)
N$305: LD89.K(C) U30.2(G)
N$306: LD90.K(C) U30.3(B)
N$307: C30.1 R146.1 U30.9(VDD)
N$308: R147.1 U30.8(DIN)
N$310: R148.1 U30.6(FDIN)
N$312: R143.2 R154.1 R157.2
N$313: R149.2 U30.10(DOUT)
N$314: R150.2 U30.7(REXT)
N$317: C31.1 R151.1 U27.9(VDD)
N$318: LD91.K(C) U27.1(R)
N$319: LD92.K(C) U27.2(G)
N$320: LD93.K(C) U27.3(B)
N$321: R152.1 U27.8(DIN)
N$322: R153.1 U27.6(FDIN)
N$323: R154.2 U27.10(DOUT)
N$324: R155.2 U27.7(REXT)
N$325: LD94.K(C) U28.1(R)
N$326: LD95.K(C) U28.2(G)
N$327: LD96.K(C) U28.3(B)
N$328: C32.1 R156.1 U28.9(VDD)
N$329: R157.1 U28.8(DIN)
N$331: R158.1 U28.6(FDIN)
N$333: R124.1 R127.2 R153.2
N$334: R159.2 U28.10(DOUT)
N$335: R160.2 U28.7(REXT)
N$336: R142.2 R148.2 R159.1
N$338: C33.1 R161.1 U33.9(VDD)
N$339: LD97.K(C) U33.1(R)
N$340: LD98.K(C) U33.2(G)
N$341: LD99.K(C) U33.3(B)
N$342: R162.1 U33.8(DIN)
N$343: R163.1 U33.6(FDIN)
N$344: R164.2 U33.10(DOUT)
N$345: R165.2 U33.7(REXT)
N$346: LD100.K(C) U34.1(R)
N$347: LD101.K(C) U34.2(G)
N$348: LD102.K(C) U34.3(B)
N$349: C34.1 R166.1 U34.9(VDD)
N$350: R167.1 U34.8(DIN)
N$352: R168.1 U34.6(FDIN)
N$354: R163.2 R174.1 R177.2
N$355: R169.2 U34.10(DOUT)
N$356: R170.2 U34.7(REXT)
N$357: R169.1 R182.2 R188.2
N$359: C35.1 R171.1 U31.9(VDD)
N$360: LD103.K(C) U31.1(R)
N$361: LD104.K(C) U31.2(G)
N$362: LD105.K(C) U31.3(B)
N$363: R172.1 U31.8(DIN)
N$364: R173.1 U31.6(FDIN)
N$365: R174.2 U31.10(DOUT)
N$366: R175.2 U31.7(REXT)
N$367: LD106.K(C) U32.1(R)
N$368: LD107.K(C) U32.2(G)
N$369: LD108.K(C) U32.3(B)
N$370: C36.1 R176.1 U32.9(VDD)
N$371: R177.1 U32.8(DIN)
N$373: R178.1 U32.6(FDIN)
N$376: R179.2 U32.10(DOUT)
N$377: R180.2 U32.7(REXT)
N$378: R162.2 R168.2 R179.1
N$380: C37.1 R181.1 U35.9(VDD)
N$381: LD109.K(C) U35.1(R)
N$382: LD110.K(C) U35.2(G)
N$383: LD111.K(C) U35.3(B)
N$384: R182.1 U35.8(DIN)
N$385: R183.1 U35.6(FDIN)
N$386: R184.2 U35.10(DOUT)
N$387: R185.2 U35.7(REXT)
N$388: LD112.K(C) U36.1(R)
N$389: LD113.K(C) U36.2(G)
N$390: LD114.K(C) U36.3(B)
N$391: C38.1 R186.1 U36.9(VDD)
N$392: R187.1 U36.8(DIN)
N$394: R188.1 U36.6(FDIN)
N$396: R164.1 R167.2 R183.2
N$397: R189.2 U36.10(DOUT)
N$398: R190.2 U36.7(REXT)
N$401: C39.1 R191.1 U37.9(VDD)
N$402: LD115.K(C) U37.1(R)
N$403: LD116.K(C) U37.2(G)
N$404: LD117.K(C) U37.3(B)
N$405: R192.1 U37.8(DIN)
N$406: R193.1 U37.6(FDIN)
N$407: R194.2 U37.10(DOUT)
N$408: R195.2 U37.7(REXT)
N$409: LD118.K(C) U38.1(R)
N$410: LD119.K(C) U38.2(G)
N$411: LD120.K(C) U38.3(B)
N$412: C40.1 R196.1 U38.9(VDD)
N$413: R197.1 U38.8(DIN)
N$415: R198.1 U38.6(FDIN)
N$418: R199.2 U38.10(DOUT)
N$419: R200.2 U38.7(REXT)
N$420: R199.1 R202.2 R208.2
N$422: C41.1 R201.1 U39.9(VDD)
N$423: LD121.K(C) U39.1(R)
N$424: LD122.K(C) U39.2(G)
N$425: LD123.K(C) U39.3(B)
N$426: R202.1 U39.8(DIN)
N$427: R203.1 U39.6(FDIN)
N$428: R204.2 U39.10(DOUT)
N$429: R205.2 U39.7(REXT)
N$430: LD124.K(C) U40.1(R)
N$431: LD125.K(C) U40.2(G)
N$432: LD126.K(C) U40.3(B)
N$433: C42.1 R206.1 U40.9(VDD)
N$434: R207.1 U40.8(DIN)
N$436: R208.1 U40.6(FDIN)
N$438: R194.1 R197.2 R203.2
N$439: R209.2 U40.10(DOUT)
N$440: R210.2 U40.7(REXT)
N$441: R209.1 R212.2 R218.2
N$443: C43.1 R211.1 U41.9(VDD)
N$444: LD127.K(C) U41.1(R)
N$445: LD128.K(C) U41.2(G)
N$446: LD129.K(C) U41.3(B)
N$447: R212.1 U41.8(DIN)
N$448: R213.1 U41.6(FDIN)
N$449: R214.2 U41.10(DOUT)
N$450: R215.2 U41.7(REXT)
N$451: LD130.K(C) U42.1(R)
N$452: LD131.K(C) U42.2(G)
N$453: LD132.K(C) U42.3(B)
N$454: C44.1 R216.1 U42.9(VDD)
N$455: R217.1 U42.8(DIN)
N$457: R218.1 U42.6(FDIN)
N$459: R204.1 R207.2 R213.2
N$460: R219.2 U42.10(DOUT)
N$461: R220.2 U42.7(REXT)
N$464: C45.1 R221.1 U43.9(VDD)
N$465: LD133.K(C) U43.1(R)
N$466: LD134.K(C) U43.2(G)
N$467: LD135.K(C) U43.3(B)
N$468: R222.1 U43.8(DIN)
N$469: R223.1 U43.6(FDIN)
N$470: R224.2 U43.10(DOUT)
N$471: R225.2 U43.7(REXT)
N$472: LD136.K(C) U44.1(R)
N$473: LD137.K(C) U44.2(G)
N$474: LD138.K(C) U44.3(B)
N$475: C46.1 R226.1 U44.9(VDD)
N$476: R227.1 U44.8(DIN)
N$478: R228.1 U44.6(FDIN)
N$481: R229.2 U44.10(DOUT)
N$482: R230.2 U44.7(REXT)
N$483: R229.1 R232.2 R238.2
N$485: C47.1 R231.1 U45.9(VDD)
N$486: LD139.K(C) U45.1(R)
N$487: LD140.K(C) U45.2(G)
N$488: LD141.K(C) U45.3(B)
N$489: R232.1 U45.8(DIN)
N$490: R233.1 U45.6(FDIN)
N$491: R234.2 U45.10(DOUT)
N$492: R235.2 U45.7(REXT)
N$493: LD142.K(C) U46.1(R)
N$494: LD143.K(C) U46.2(G)
N$495: LD144.K(C) U46.3(B)
N$496: C48.1 R236.1 U46.9(VDD)
N$497: R237.1 U46.8(DIN)
N$499: R238.1 U46.6(FDIN)
N$501: R224.1 R227.2 R233.2
N$502: R239.2 U46.10(DOUT)
N$503: R240.2 U46.7(REXT)
N$504: R239.1 R242.2 R248.2
N$506: C49.1 R241.1 U47.9(VDD)
N$507: LD145.K(C) U47.1(R)
N$508: LD146.K(C) U47.2(G)
N$509: LD147.K(C) U47.3(B)
N$510: R242.1 U47.8(DIN)
N$511: R243.1 U47.6(FDIN)
N$512: R244.2 U47.10(DOUT)
N$513: R245.2 U47.7(REXT)
N$514: LD148.K(C) U48.1(R)
N$515: LD149.K(C) U48.2(G)
N$516: LD150.K(C) U48.3(B)
N$517: C50.1 R246.1 U48.9(VDD)
N$518: R247.1 U48.8(DIN)
N$520: R248.1 U48.6(FDIN)
N$522: R234.1 R237.2 R243.2
N$523: R249.2 U48.10(DOUT)
N$524: R250.2 U48.7(REXT)
Unconnected: U25.4(W) U26.4(W) U27.4(W) U28.4(W) U29.4(W) U30.4(W) U31.4(W) U32.4(W) U33.4(W) U34.4(W) U35.4(W) U36.4(W) U37.4(W) U38.4(W) U39.4(W) U40.4(W) U41.4(W) U42.4(W) U43.4(W) U44.4(W) U45.4(W) U46.4(W) U47.4(W) U48.4(W)

## Sheet 3 of 17: Row 3
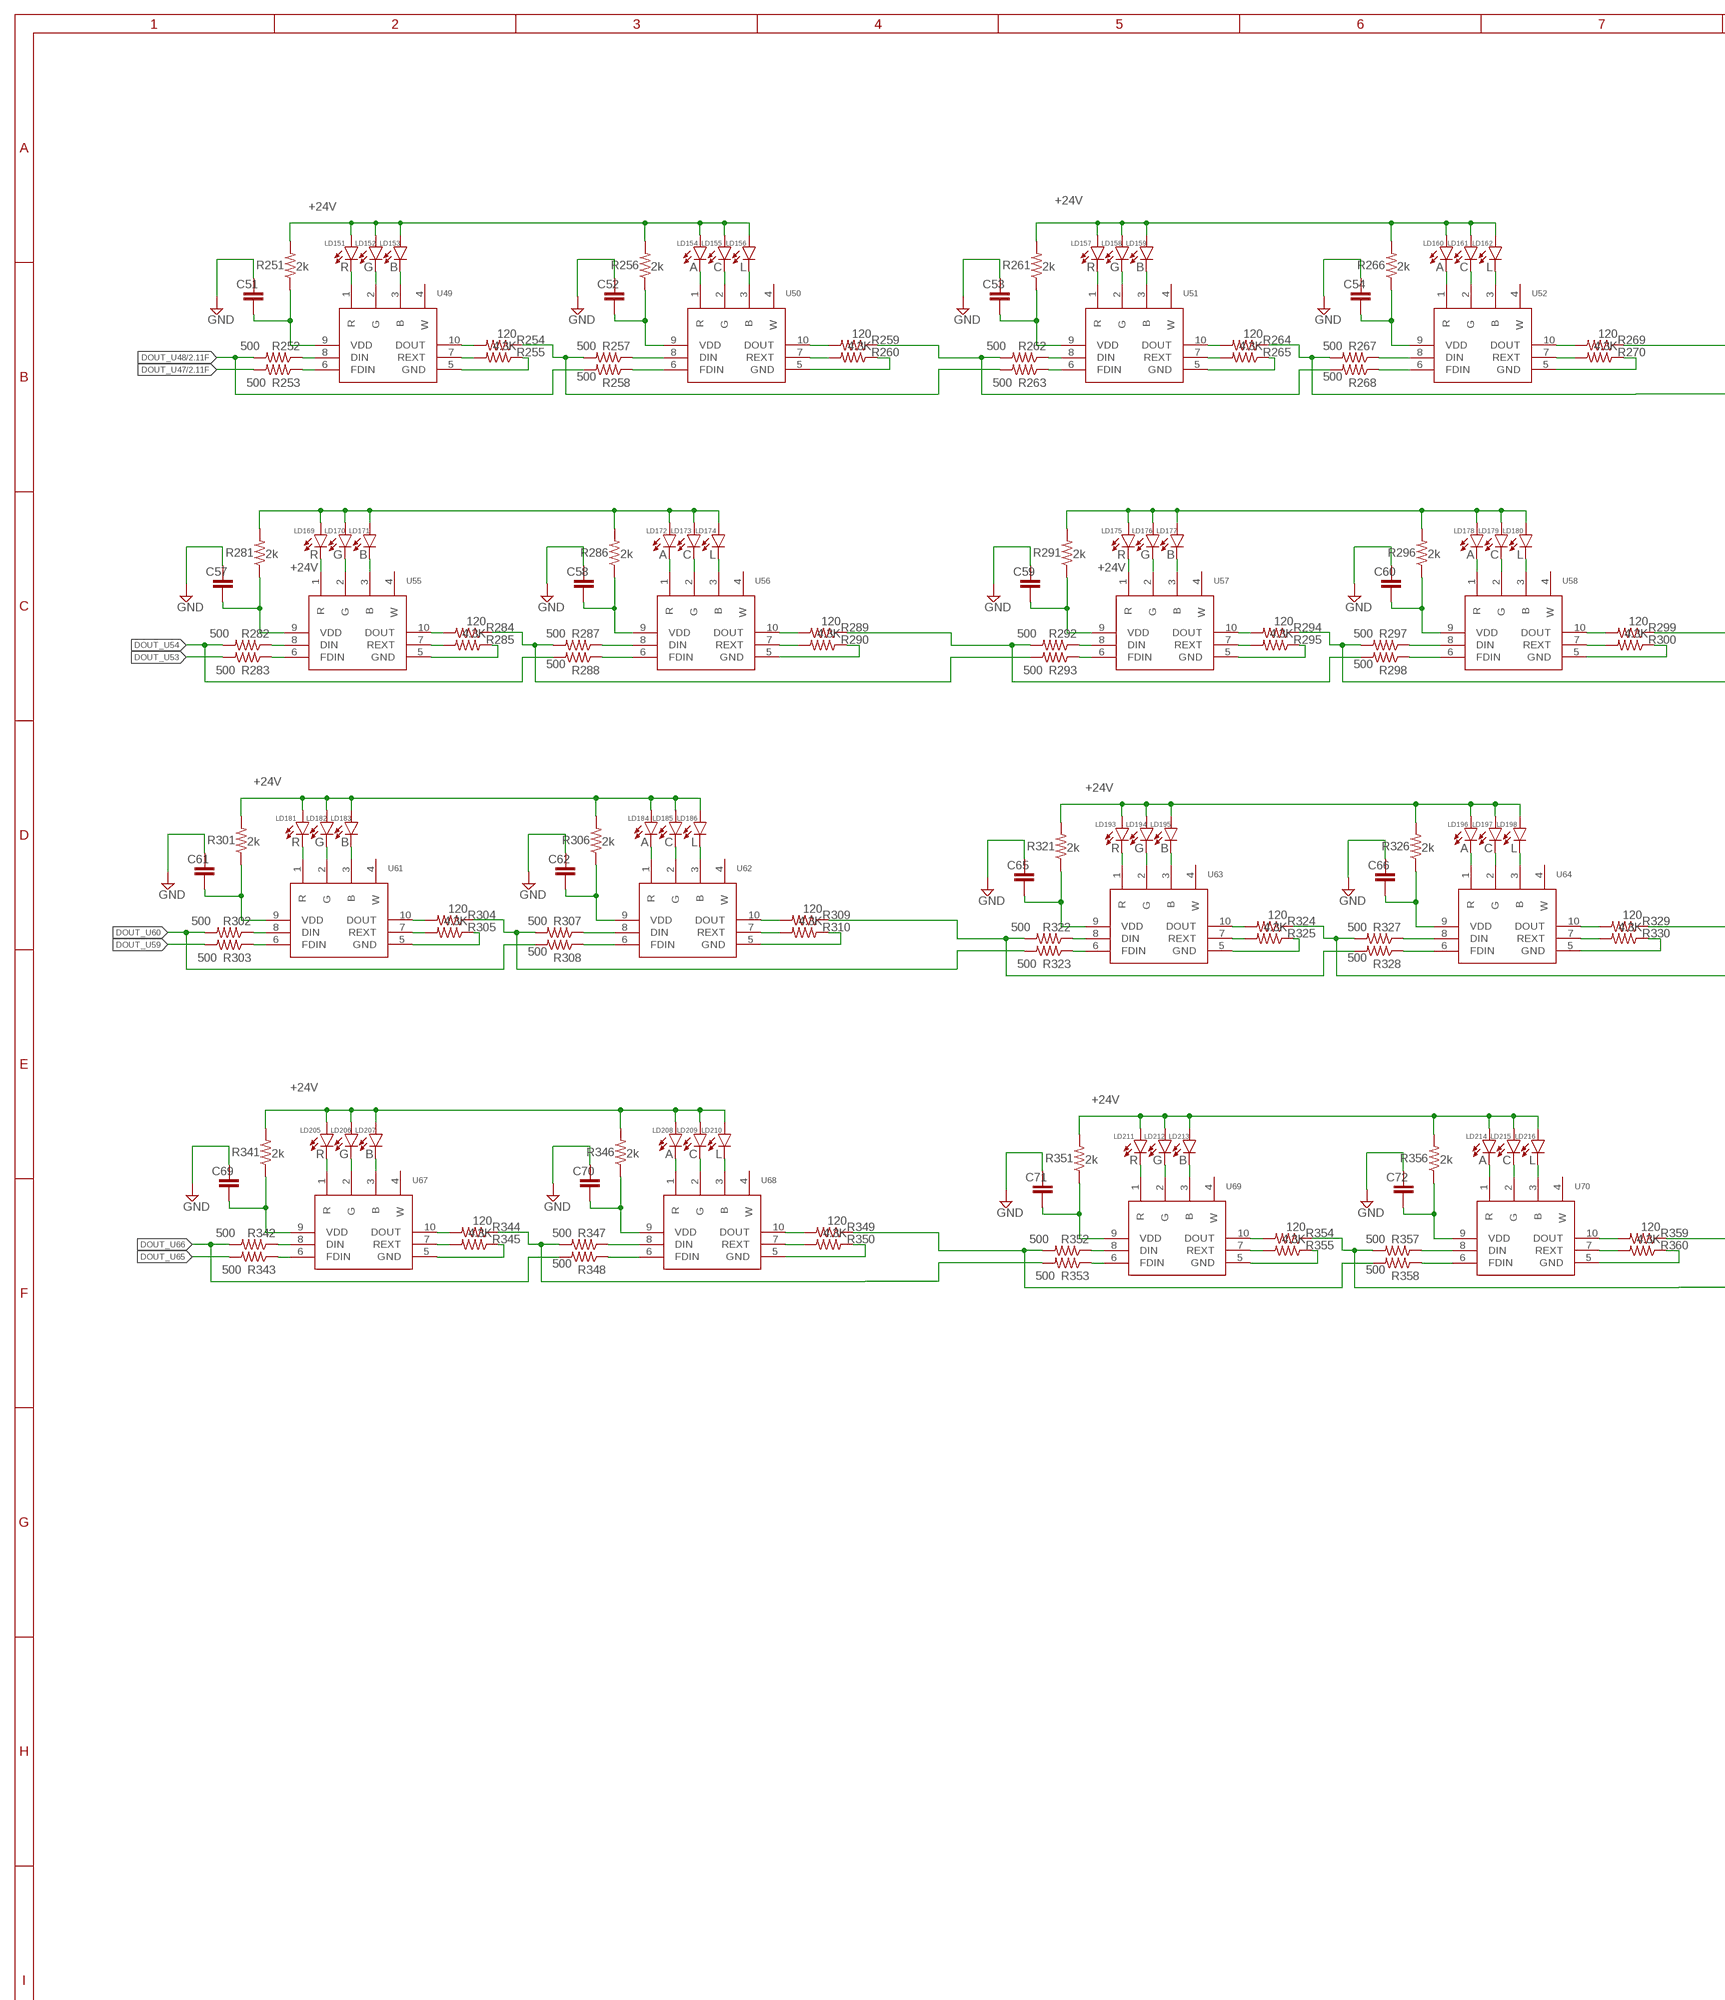
[diagram p4: schematic, sheet 3, part 1 of 2]
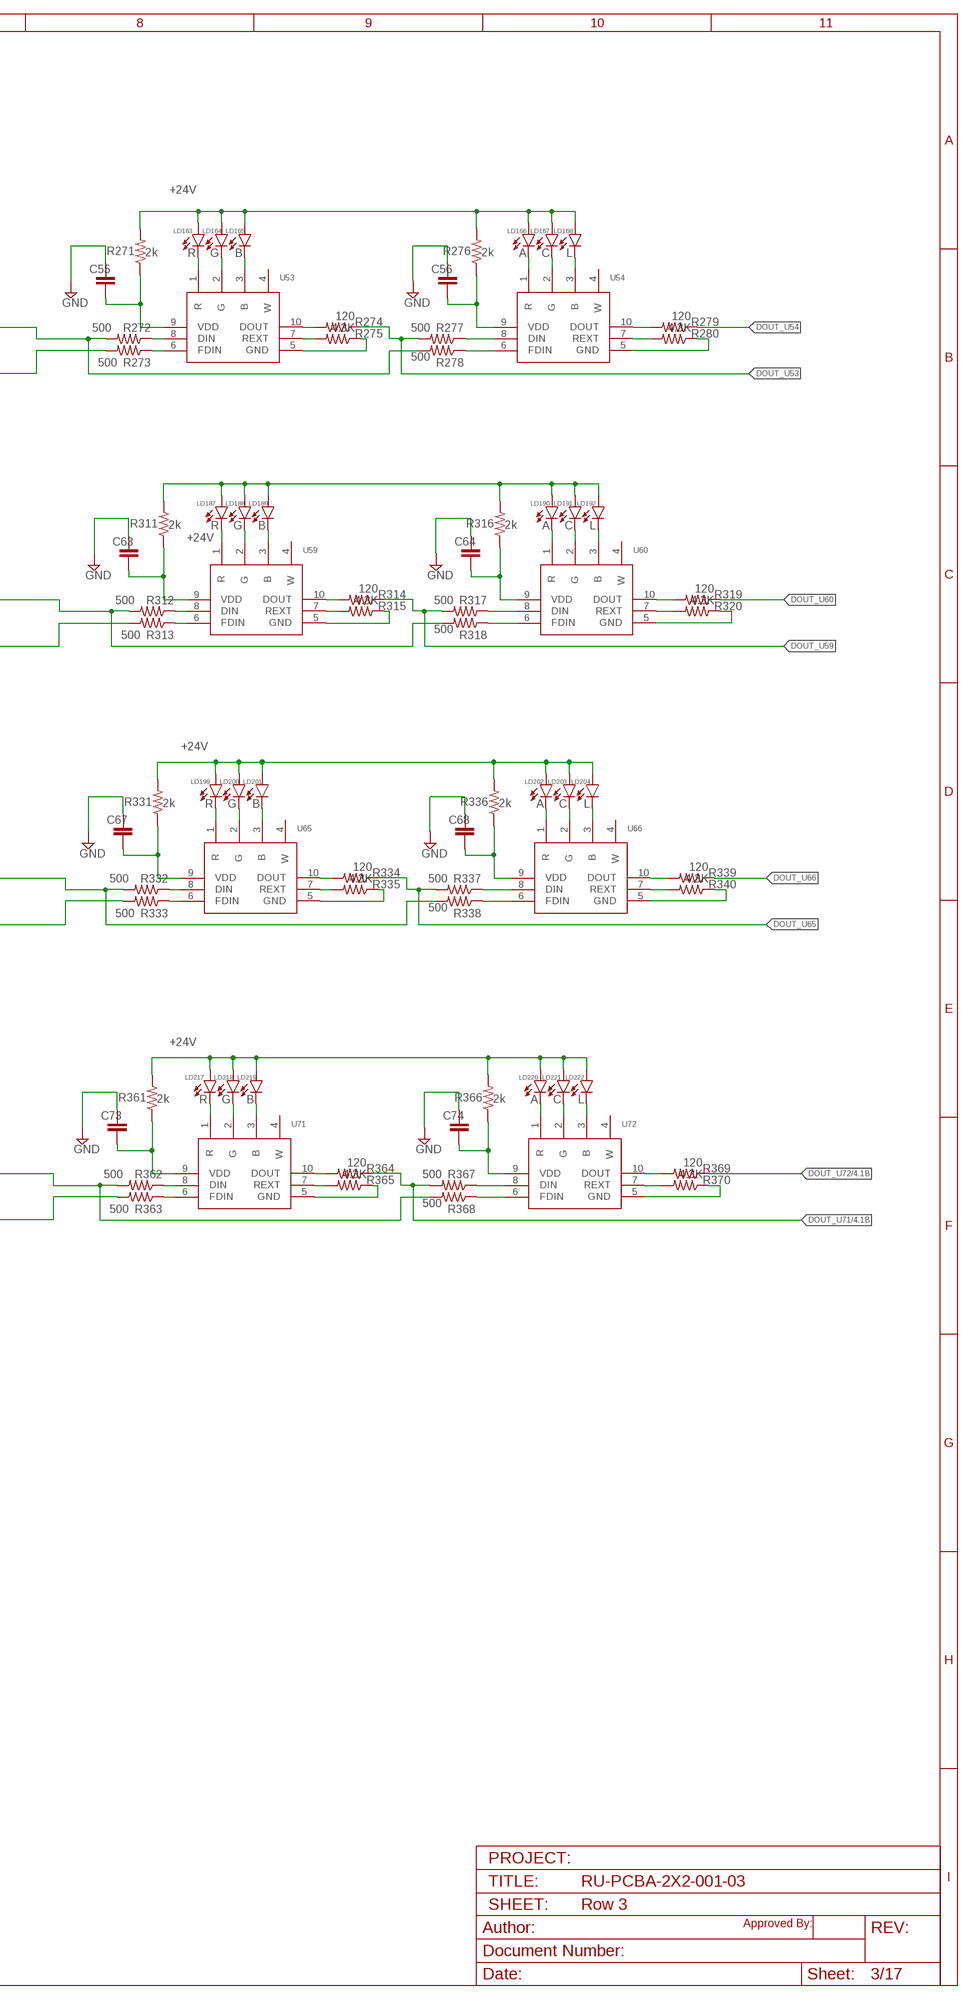
[diagram p5: schematic, sheet 3, part 2 of 2]

### Parts
C51  C-EUC1206  [C1206]
C52  C-EUC1206  [C1206]
C53  C-EUC1206  [C1206]
C54  C-EUC1206  [C1206]
C55  C-EUC1206  [C1206]
C56  C-EUC1206  [C1206]
C57  C-EUC1206  [C1206]
C58  C-EUC1206  [C1206]
C59  C-EUC1206  [C1206]
C60  C-EUC1206  [C1206]
C61  C-EUC1206  [C1206]
C62  C-EUC1206  [C1206]
C63  C-EUC1206  [C1206]
C64  C-EUC1206  [C1206]
C65  C-EUC1206  [C1206]
C66  C-EUC1206  [C1206]
C67  C-EUC1206  [C1206]
C68  C-EUC1206  [C1206]
C69  C-EUC1206  [C1206]
C70  C-EUC1206  [C1206]
C71  C-EUC1206  [C1206]
C72  C-EUC1206  [C1206]
C73  C-EUC1206  [C1206]
C74  C-EUC1206  [C1206]
LD151  R  5050LED  [5050LED]
LD152  G  5050LED  [5050LED]
LD153  B  5050LED  [5050LED]
LD154  A  5050LED  [5050LED]
LD155  C  5050LED  [5050LED]
LD156  L  5050LED  [5050LED]
LD157  R  5050LED  [5050LED]
LD158  G  5050LED  [5050LED]
LD159  B  5050LED  [5050LED]
LD160  A  5050LED  [5050LED]
LD161  C  5050LED  [5050LED]
LD162  L  5050LED  [5050LED]
LD163  R  5050LED  [5050LED]
LD164  G  5050LED  [5050LED]
LD165  B  5050LED  [5050LED]
LD166  A  5050LED  [5050LED]
LD167  C  5050LED  [5050LED]
LD168  L  5050LED  [5050LED]
LD169  R  5050LED  [5050LED]
LD170  G  5050LED  [5050LED]
LD171  B  5050LED  [5050LED]
LD172  A  5050LED  [5050LED]
LD173  C  5050LED  [5050LED]
LD174  L  5050LED  [5050LED]
LD175  R  5050LED  [5050LED]
LD176  G  5050LED  [5050LED]
LD177  B  5050LED  [5050LED]
LD178  A  5050LED  [5050LED]
LD179  C  5050LED  [5050LED]
LD180  L  5050LED  [5050LED]
LD181  R  5050LED  [5050LED]
LD182  G  5050LED  [5050LED]
LD183  B  5050LED  [5050LED]
LD184  A  5050LED  [5050LED]
LD185  C  5050LED  [5050LED]
LD186  L  5050LED  [5050LED]
LD187  R  5050LED  [5050LED]
LD188  G  5050LED  [5050LED]
LD189  B  5050LED  [5050LED]
LD190  A  5050LED  [5050LED]
LD191  C  5050LED  [5050LED]
LD192  L  5050LED  [5050LED]
LD193  R  5050LED  [5050LED]
LD194  G  5050LED  [5050LED]
LD195  B  5050LED  [5050LED]
LD196  A  5050LED  [5050LED]
LD197  C  5050LED  [5050LED]
LD198  L  5050LED  [5050LED]
LD199  R  5050LED  [5050LED]
LD200  G  5050LED  [5050LED]
LD201  B  5050LED  [5050LED]
LD202  A  5050LED  [5050LED]
LD203  C  5050LED  [5050LED]
LD204  L  5050LED  [5050LED]
LD205  R  5050LED  [5050LED]
LD206  G  5050LED  [5050LED]
LD207  B  5050LED  [5050LED]
LD208  A  5050LED  [5050LED]
LD209  C  5050LED  [5050LED]
LD210  L  5050LED  [5050LED]
LD211  R  5050LED  [5050LED]
LD212  G  5050LED  [5050LED]
LD213  B  5050LED  [5050LED]
LD214  A  5050LED  [5050LED]
LD215  C  5050LED  [5050LED]
LD216  L  5050LED  [5050LED]
LD217  R  5050LED  [5050LED]
LD218  G  5050LED  [5050LED]
LD219  B  5050LED  [5050LED]
LD220  A  5050LED  [5050LED]
LD221  C  5050LED  [5050LED]
LD222  L  5050LED  [5050LED]
R251  2k  R-US_R1206  [R1206]
R252  500  R-US_R0805  [R0805]
R253  500  R-US_R0805  [R0805]
R254  120  R-US_R0805  [R0805]
R255  4.3K  R-US_R0805  [R0805]
R256  2k  R-US_R1206  [R1206]
R257  500  R-US_R0805  [R0805]
R258  500  R-US_R0805  [R0805]
R259  120  R-US_R0805  [R0805]
R260  4.3K  R-US_R0805  [R0805]
R261  2k  R-US_R1206  [R1206]
R262  500  R-US_R0805  [R0805]
R263  500  R-US_R0805  [R0805]
R264  120  R-US_R0805  [R0805]
R265  4.3K  R-US_R0805  [R0805]
R266  2k  R-US_R1206  [R1206]
R267  500  R-US_R0805  [R0805]
R268  500  R-US_R0805  [R0805]
R269  120  R-US_R0805  [R0805]
R270  4.3K  R-US_R0805  [R0805]
R271  2k  R-US_R1206  [R1206]
R272  500  R-US_R0805  [R0805]
R273  500  R-US_R0805  [R0805]
R274  120  R-US_R0805  [R0805]
R275  4.3K  R-US_R0805  [R0805]
R276  2k  R-US_R1206  [R1206]
R277  500  R-US_R0805  [R0805]
R278  500  R-US_R0805  [R0805]
R279  120  R-US_R0805  [R0805]
R280  4.3K  R-US_R0805  [R0805]
R281  2k  R-US_R1206  [R1206]
R282  500  R-US_R0805  [R0805]
R283  500  R-US_R0805  [R0805]
R284  120  R-US_R0805  [R0805]
R285  4.3K  R-US_R0805  [R0805]
R286  2k  R-US_R1206  [R1206]
R287  500  R-US_R0805  [R0805]
R288  500  R-US_R0805  [R0805]
R289  120  R-US_R0805  [R0805]
R290  4.3K  R-US_R0805  [R0805]
R291  2k  R-US_R1206  [R1206]
R292  500  R-US_R0805  [R0805]
R293  500  R-US_R0805  [R0805]
R294  120  R-US_R0805  [R0805]
R295  4.3K  R-US_R0805  [R0805]
R296  2k  R-US_R1206  [R1206]
R297  500  R-US_R0805  [R0805]
R298  500  R-US_R0805  [R0805]
R299  120  R-US_R0805  [R0805]
R300  4.3K  R-US_R0805  [R0805]
R301  2k  R-US_R1206  [R1206]
R302  500  R-US_R0805  [R0805]
R303  500  R-US_R0805  [R0805]
R304  120  R-US_R0805  [R0805]
R305  4.3K  R-US_R0805  [R0805]
R306  2k  R-US_R1206  [R1206]
R307  500  R-US_R0805  [R0805]
R308  500  R-US_R0805  [R0805]
R309  120  R-US_R0805  [R0805]
R310  4.3K  R-US_R0805  [R0805]
R311  2k  R-US_R1206  [R1206]
R312  500  R-US_R0805  [R0805]
R313  500  R-US_R0805  [R0805]
R314  120  R-US_R0805  [R0805]
R315  4.3K  R-US_R0805  [R0805]
R316  2k  R-US_R1206  [R1206]
R317  500  R-US_R0805  [R0805]
R318  500  R-US_R0805  [R0805]
R319  120  R-US_R0805  [R0805]
R320  4.3K  R-US_R0805  [R0805]
R321  2k  R-US_R1206  [R1206]
R322  500  R-US_R0805  [R0805]
R323  500  R-US_R0805  [R0805]
R324  120  R-US_R0805  [R0805]
R325  4.3K  R-US_R0805  [R0805]
R326  2k  R-US_R1206  [R1206]
R327  500  R-US_R0805  [R0805]
R328  500  R-US_R0805  [R0805]
R329  120  R-US_R0805  [R0805]
R330  4.3K  R-US_R0805  [R0805]
R331  2k  R-US_R1206  [R1206]
R332  500  R-US_R0805  [R0805]
R333  500  R-US_R0805  [R0805]
R334  120  R-US_R0805  [R0805]
R335  4.3K  R-US_R0805  [R0805]
R336  2k  R-US_R1206  [R1206]
R337  500  R-US_R0805  [R0805]
R338  500  R-US_R0805  [R0805]
R339  120  R-US_R0805  [R0805]
R340  4.3K  R-US_R0805  [R0805]
R341  2k  R-US_R1206  [R1206]
R342  500  R-US_R0805  [R0805]
R343  500  R-US_R0805  [R0805]
R344  120  R-US_R0805  [R0805]
R345  4.3K  R-US_R0805  [R0805]
R346  2k  R-US_R1206  [R1206]
R347  500  R-US_R0805  [R0805]
R348  500  R-US_R0805  [R0805]
R349  120  R-US_R0805  [R0805]
R350  4.3K  R-US_R0805  [R0805]
R351  2k  R-US_R1206  [R1206]
R352  500  R-US_R0805  [R0805]
R353  500  R-US_R0805  [R0805]
R354  120  R-US_R0805  [R0805]
R355  4.3K  R-US_R0805  [R0805]
R356  2k  R-US_R1206  [R1206]
R357  500  R-US_R0805  [R0805]
R358  500  R-US_R0805  [R0805]
R359  120  R-US_R0805  [R0805]
R360  4.3K  R-US_R0805  [R0805]
R361  2k  R-US_R1206  [R1206]
R362  500  R-US_R0805  [R0805]
R363  500  R-US_R0805  [R0805]
R364  120  R-US_R0805  [R0805]
R365  4.3K  R-US_R0805  [R0805]
R366  2k  R-US_R1206  [R1206]
R367  500  R-US_R0805  [R0805]
R368  500  R-US_R0805  [R0805]
R369  120  R-US_R0805  [R0805]
R370  4.3K  R-US_R0805  [R0805]
U49  UCS7604  [SOP100P600X175-10N]
U50  UCS7604  [SOP100P600X175-10N]
U51  UCS7604  [SOP100P600X175-10N]
U52  UCS7604  [SOP100P600X175-10N]
U53  UCS7604  [SOP100P600X175-10N]
U54  UCS7604  [SOP100P600X175-10N]
U55  UCS7604  [SOP100P600X175-10N]
U56  UCS7604  [SOP100P600X175-10N]
U57  UCS7604  [SOP100P600X175-10N]
U58  UCS7604  [SOP100P600X175-10N]
U59  UCS7604  [SOP100P600X175-10N]
U60  UCS7604  [SOP100P600X175-10N]
U61  UCS7604  [SOP100P600X175-10N]
U62  UCS7604  [SOP100P600X175-10N]
U63  UCS7604  [SOP100P600X175-10N]
U64  UCS7604  [SOP100P600X175-10N]
U65  UCS7604  [SOP100P600X175-10N]
U66  UCS7604  [SOP100P600X175-10N]
U67  UCS7604  [SOP100P600X175-10N]
U68  UCS7604  [SOP100P600X175-10N]
U69  UCS7604  [SOP100P600X175-10N]
U70  UCS7604  [SOP100P600X175-10N]
U71  UCS7604  [SOP100P600X175-10N]
U72  UCS7604  [SOP100P600X175-10N]

### Nets
+24V: LD151.A LD152.A LD153.A LD154.A LD155.A LD156.A LD157.A LD158.A LD159.A LD160.A LD161.A LD162.A LD163.A LD164.A LD165.A LD166.A LD167.A LD168.A LD169.A LD170.A LD171.A LD172.A LD173.A LD174.A LD175.A LD176.A LD177.A LD178.A LD179.A LD180.A LD181.A LD182.A LD183.A LD184.A LD185.A LD186.A LD187.A LD188.A LD189.A LD190.A LD191.A LD192.A LD193.A LD194.A LD195.A LD196.A LD197.A LD198.A LD199.A LD200.A LD201.A LD202.A LD203.A LD204.A LD205.A LD206.A LD207.A LD208.A LD209.A LD210.A LD211.A LD212.A LD213.A LD214.A LD215.A LD216.A LD217.A LD218.A LD219.A LD220.A LD221.A LD222.A R251.2 R256.2 R261.2 R266.2 R271.2 R276.2 R281.2 R286.2 R291.2 R296.2 R301.2 R306.2 R311.2 R316.2 R321.2 R326.2 R331.2 R336.2 R341.2 R346.2 R351.2 R356.2 R361.2 R366.2 ; also sheet 1,2,4,5,6,7,8,9,10,11,12,13,14
DOUT_U47: R253.2 ; also sheet 2
DOUT_U48: R252.2 R258.2 ; also sheet 2
DOUT_U53: R274.1 R277.2 R283.2
DOUT_U54: R279.1 R282.2 R288.2
DOUT_U59: R303.2 R314.1 R317.2
DOUT_U60: R302.2 R308.2 R319.1
DOUT_U65: R334.1 R337.2 R343.2
DOUT_U66: R339.1 R342.2 R348.2
DOUT_U71: R364.1 R367.2 ; also sheet 4
DOUT_U72: R369.1 ; also sheet 4
GND: C51.2 C52.2 C53.2 C54.2 C55.2 C56.2 C57.2 C58.2 C59.2 C60.2 C61.2 C62.2 C63.2 C64.2 C65.2 C66.2 C67.2 C68.2 C69.2 C70.2 C71.2 C72.2 C73.2 C74.2 R255.1 R260.1 R265.1 R270.1 R275.1 R280.1 R285.1 R290.1 R295.1 R300.1 R305.1 R310.1 R315.1 R320.1 R325.1 R330.1 R335.1 R340.1 R345.1 R350.1 R355.1 R360.1 R365.1 R370.1 U49.5(GND) U50.5(GND) U51.5(GND) U52.5(GND) U53.5(GND) U54.5(GND) U55.5(GND) U56.5(GND) U57.5(GND) U58.5(GND) U59.5(GND) U60.5(GND) U61.5(GND) U62.5(GND) U63.5(GND) U64.5(GND) U65.5(GND) U66.5(GND) U67.5(GND) U68.5(GND) U69.5(GND) U70.5(GND) U71.5(GND) U72.5(GND) ; also sheet 1,2,4,5,6,7,8,9,10,11,12,13,14
N$527: C51.1 R251.1 U49.9(VDD)
N$528: LD151.K(C) U49.1(R)
N$529: LD152.K(C) U49.2(G)
N$530: LD153.K(C) U49.3(B)
N$531: R252.1 U49.8(DIN)
N$532: R253.1 U49.6(FDIN)
N$533: R254.2 U49.10(DOUT)
N$534: R255.2 U49.7(REXT)
N$535: LD154.K(C) U50.1(R)
N$536: LD155.K(C) U50.2(G)
N$537: LD156.K(C) U50.3(B)
N$538: C52.1 R256.1 U50.9(VDD)
N$539: R257.1 U50.8(DIN)
N$541: R258.1 U50.6(FDIN)
N$544: R259.2 U50.10(DOUT)
N$545: R260.2 U50.7(REXT)
N$546: R259.1 R262.2 R268.2
N$548: C53.1 R261.1 U51.9(VDD)
N$549: LD157.K(C) U51.1(R)
N$550: LD158.K(C) U51.2(G)
N$551: LD159.K(C) U51.3(B)
N$552: R262.1 U51.8(DIN)
N$553: R263.1 U51.6(FDIN)
N$554: R264.2 U51.10(DOUT)
N$555: R265.2 U51.7(REXT)
N$556: LD160.K(C) U52.1(R)
N$557: LD161.K(C) U52.2(G)
N$558: LD162.K(C) U52.3(B)
N$559: C54.1 R266.1 U52.9(VDD)
N$560: R267.1 U52.8(DIN)
N$562: R268.1 U52.6(FDIN)
N$564: R254.1 R257.2 R263.2
N$565: R269.2 U52.10(DOUT)
N$566: R270.2 U52.7(REXT)
N$567: R269.1 R272.2 R278.2
N$569: C55.1 R271.1 U53.9(VDD)
N$570: LD163.K(C) U53.1(R)
N$571: LD164.K(C) U53.2(G)
N$572: LD165.K(C) U53.3(B)
N$573: R272.1 U53.8(DIN)
N$574: R273.1 U53.6(FDIN)
N$575: R274.2 U53.10(DOUT)
N$576: R275.2 U53.7(REXT)
N$577: LD166.K(C) U54.1(R)
N$578: LD167.K(C) U54.2(G)
N$579: LD168.K(C) U54.3(B)
N$580: C56.1 R276.1 U54.9(VDD)
N$581: R277.1 U54.8(DIN)
N$583: R278.1 U54.6(FDIN)
N$585: R264.1 R267.2 R273.2
N$586: R279.2 U54.10(DOUT)
N$587: R280.2 U54.7(REXT)
N$590: C57.1 R281.1 U55.9(VDD)
N$591: LD169.K(C) U55.1(R)
N$592: LD170.K(C) U55.2(G)
N$593: LD171.K(C) U55.3(B)
N$594: R282.1 U55.8(DIN)
N$595: R283.1 U55.6(FDIN)
N$596: R284.2 U55.10(DOUT)
N$597: R285.2 U55.7(REXT)
N$598: LD172.K(C) U56.1(R)
N$599: LD173.K(C) U56.2(G)
N$600: LD174.K(C) U56.3(B)
N$601: C58.1 R286.1 U56.9(VDD)
N$602: R287.1 U56.8(DIN)
N$603: R284.1 R287.2 R293.2
N$604: R288.1 U56.6(FDIN)
N$607: R289.2 U56.10(DOUT)
N$608: R290.2 U56.7(REXT)
N$609: R289.1 R292.2 R298.2
N$611: C59.1 R291.1 U57.9(VDD)
N$612: LD175.K(C) U57.1(R)
N$613: LD176.K(C) U57.2(G)
N$614: LD177.K(C) U57.3(B)
N$615: R292.1 U57.8(DIN)
N$616: R293.1 U57.6(FDIN)
N$617: R294.2 U57.10(DOUT)
N$618: R295.2 U57.7(REXT)
N$619: LD178.K(C) U58.1(R)
N$620: LD179.K(C) U58.2(G)
N$621: LD180.K(C) U58.3(B)
N$622: C60.1 R296.1 U58.9(VDD)
N$623: R297.1 U58.8(DIN)
N$624: R294.1 R297.2 R313.2
N$625: R298.1 U58.6(FDIN)
N$628: R299.2 U58.10(DOUT)
N$629: R300.2 U58.7(REXT)
N$630: R299.1 R312.2 R318.2
N$632: C61.1 R301.1 U61.9(VDD)
N$633: LD181.K(C) U61.1(R)
N$634: LD182.K(C) U61.2(G)
N$635: LD183.K(C) U61.3(B)
N$636: R302.1 U61.8(DIN)
N$637: R303.1 U61.6(FDIN)
N$638: R304.2 U61.10(DOUT)
N$639: R305.2 U61.7(REXT)
N$640: LD184.K(C) U62.1(R)
N$641: LD185.K(C) U62.2(G)
N$642: LD186.K(C) U62.3(B)
N$643: C62.1 R306.1 U62.9(VDD)
N$644: R307.1 U62.8(DIN)
N$646: R308.1 U62.6(FDIN)
N$649: R309.2 U62.10(DOUT)
N$650: R310.2 U62.7(REXT)
N$651: R309.1 R322.2 R328.2
N$653: C63.1 R311.1 U59.9(VDD)
N$654: LD187.K(C) U59.1(R)
N$655: LD188.K(C) U59.2(G)
N$656: LD189.K(C) U59.3(B)
N$657: R312.1 U59.8(DIN)
N$658: R313.1 U59.6(FDIN)
N$659: R314.2 U59.10(DOUT)
N$660: R315.2 U59.7(REXT)
N$661: LD190.K(C) U60.1(R)
N$662: LD191.K(C) U60.2(G)
N$663: LD192.K(C) U60.3(B)
N$664: C64.1 R316.1 U60.9(VDD)
N$665: R317.1 U60.8(DIN)
N$667: R318.1 U60.6(FDIN)
N$670: R319.2 U60.10(DOUT)
N$671: R320.2 U60.7(REXT)
N$674: C65.1 R321.1 U63.9(VDD)
N$675: LD193.K(C) U63.1(R)
N$676: LD194.K(C) U63.2(G)
N$677: LD195.K(C) U63.3(B)
N$678: R322.1 U63.8(DIN)
N$679: R323.1 U63.6(FDIN)
N$680: R324.2 U63.10(DOUT)
N$681: R325.2 U63.7(REXT)
N$682: LD196.K(C) U64.1(R)
N$683: LD197.K(C) U64.2(G)
N$684: LD198.K(C) U64.3(B)
N$685: C66.1 R326.1 U64.9(VDD)
N$686: R327.1 U64.8(DIN)
N$688: R328.1 U64.6(FDIN)
N$690: R304.1 R307.2 R323.2
N$691: R329.2 U64.10(DOUT)
N$692: R330.2 U64.7(REXT)
N$693: R329.1 R332.2 R338.2
N$695: C67.1 R331.1 U65.9(VDD)
N$696: LD199.K(C) U65.1(R)
N$697: LD200.K(C) U65.2(G)
N$698: LD201.K(C) U65.3(B)
N$699: R332.1 U65.8(DIN)
N$700: R333.1 U65.6(FDIN)
N$701: R334.2 U65.10(DOUT)
N$702: R335.2 U65.7(REXT)
N$703: LD202.K(C) U66.1(R)
N$704: LD203.K(C) U66.2(G)
N$705: LD204.K(C) U66.3(B)
N$706: C68.1 R336.1 U66.9(VDD)
N$707: R337.1 U66.8(DIN)
N$709: R338.1 U66.6(FDIN)
N$711: R324.1 R327.2 R333.2
N$712: R339.2 U66.10(DOUT)
N$713: R340.2 U66.7(REXT)
N$716: C69.1 R341.1 U67.9(VDD)
N$717: LD205.K(C) U67.1(R)
N$718: LD206.K(C) U67.2(G)
N$719: LD207.K(C) U67.3(B)
N$720: R342.1 U67.8(DIN)
N$721: R343.1 U67.6(FDIN)
N$722: R344.2 U67.10(DOUT)
N$723: R345.2 U67.7(REXT)
N$724: LD208.K(C) U68.1(R)
N$725: LD209.K(C) U68.2(G)
N$726: LD210.K(C) U68.3(B)
N$727: C70.1 R346.1 U68.9(VDD)
N$728: R347.1 U68.8(DIN)
N$730: R348.1 U68.6(FDIN)
N$733: R349.2 U68.10(DOUT)
N$734: R350.2 U68.7(REXT)
N$735: R349.1 R352.2 R358.2
N$737: C71.1 R351.1 U69.9(VDD)
N$738: LD211.K(C) U69.1(R)
N$739: LD212.K(C) U69.2(G)
N$740: LD213.K(C) U69.3(B)
N$741: R352.1 U69.8(DIN)
N$742: R353.1 U69.6(FDIN)
N$743: R354.2 U69.10(DOUT)
N$744: R355.2 U69.7(REXT)
N$745: LD214.K(C) U70.1(R)
N$746: LD215.K(C) U70.2(G)
N$747: LD216.K(C) U70.3(B)
N$748: C72.1 R356.1 U70.9(VDD)
N$749: R357.1 U70.8(DIN)
N$751: R358.1 U70.6(FDIN)
N$753: R344.1 R347.2 R353.2
N$754: R359.2 U70.10(DOUT)
N$755: R360.2 U70.7(REXT)
N$756: R359.1 R362.2 R368.2
N$758: C73.1 R361.1 U71.9(VDD)
N$759: LD217.K(C) U71.1(R)
N$760: LD218.K(C) U71.2(G)
N$761: LD219.K(C) U71.3(B)
N$762: R362.1 U71.8(DIN)
N$763: R363.1 U71.6(FDIN)
N$764: R364.2 U71.10(DOUT)
N$765: R365.2 U71.7(REXT)
N$766: LD220.K(C) U72.1(R)
N$767: LD221.K(C) U72.2(G)
N$768: LD222.K(C) U72.3(B)
N$769: C74.1 R366.1 U72.9(VDD)
N$770: R367.1 U72.8(DIN)
N$772: R368.1 U72.6(FDIN)
N$774: R354.1 R357.2 R363.2
N$775: R369.2 U72.10(DOUT)
N$776: R370.2 U72.7(REXT)
Unconnected: U49.4(W) U50.4(W) U51.4(W) U52.4(W) U53.4(W) U54.4(W) U55.4(W) U56.4(W) U57.4(W) U58.4(W) U59.4(W) U60.4(W) U61.4(W) U62.4(W) U63.4(W) U64.4(W) U65.4(W) U66.4(W) U67.4(W) U68.4(W) U69.4(W) U70.4(W) U71.4(W) U72.4(W)